# Altium project lga1700.PrjPCB (part 6 of 11)

## Sheet DDR4_UDIMM CHANNEL-A0.schdoc
size 420 x 298 mm; Symbol: Sheet-Symbol_A3; Company: 嘉立创EDA; Version: V1.0; Page Size: A3; @Project Name: 【全网首发】X86电脑主板_copy; @Page Count: 2; @Update Date: 2025-11-04; @Create Date: 2025-11-04; @Schematic Name: SCHEMATIC1_1; @Page No: 0; @Page Name: DDR4_UDIMM CHANNEL-A0; Device: Sheet-Symbol_A3
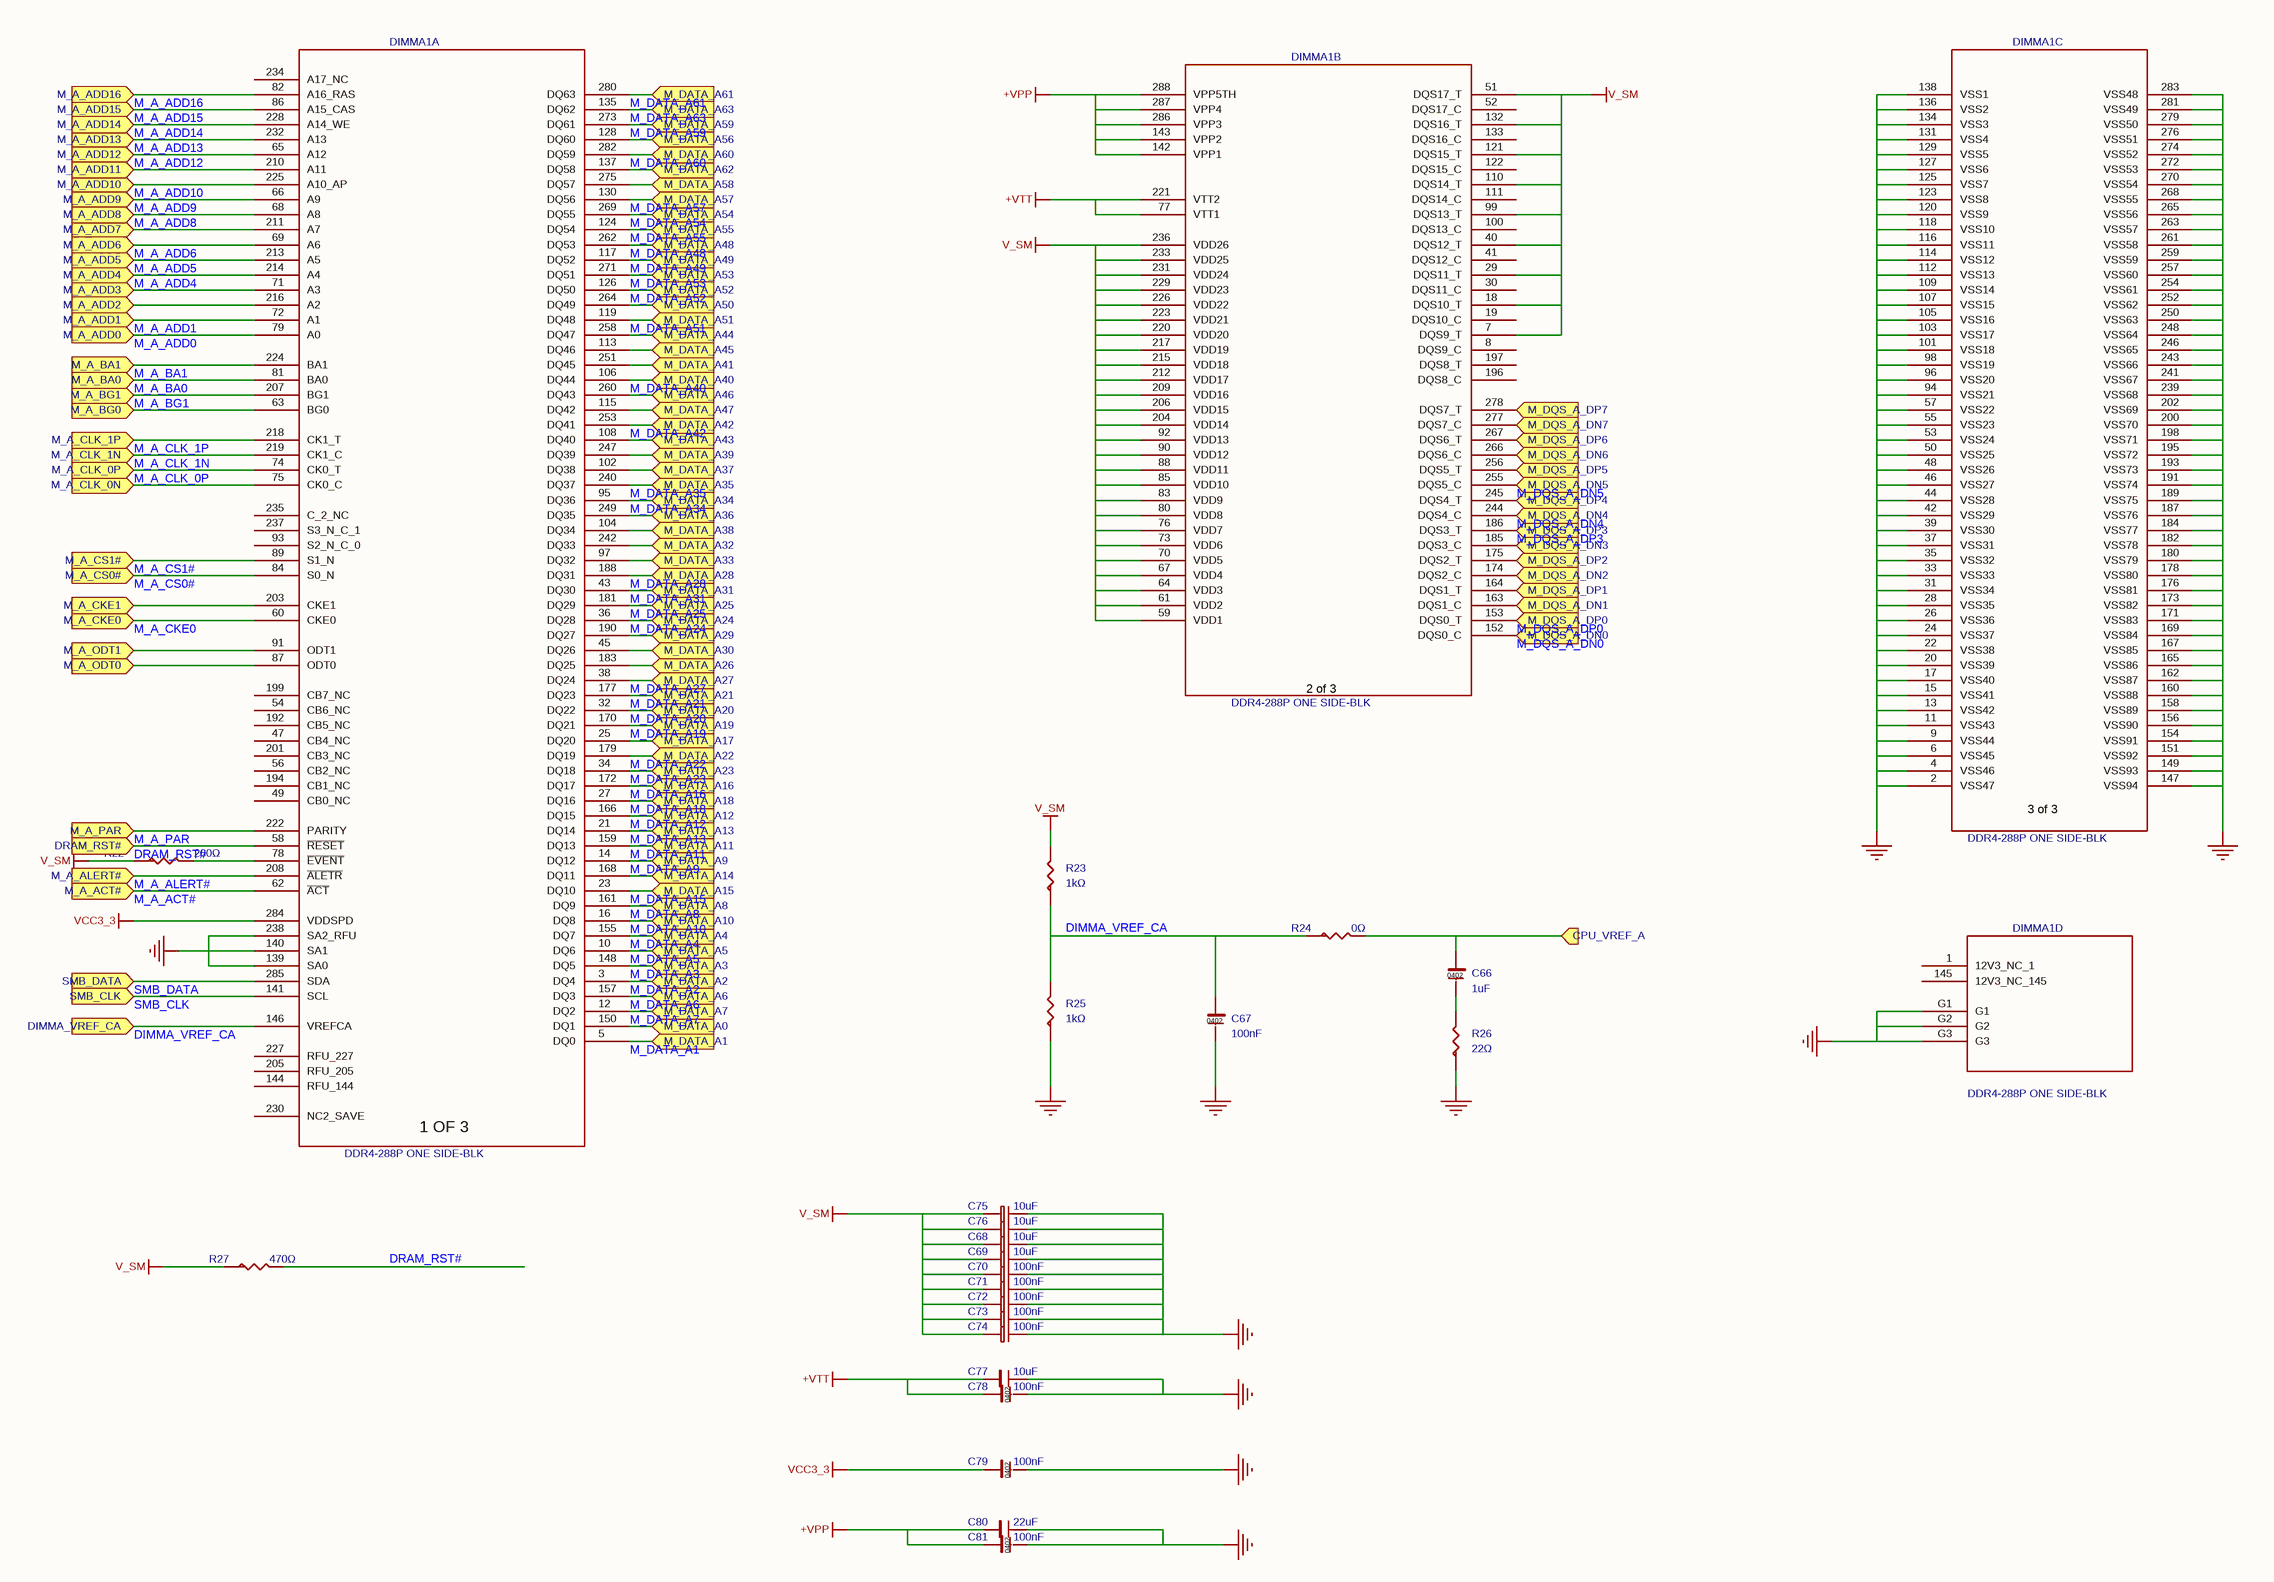
[diagram p22: DDR4_UDIMM CHANNEL-A0.schdoc]

### Parts
C66  1uF  [C0402_2]
C67  100nF  [C0402_1]
C68  10uF  [C0603_1]
C69  10uF  [C0603_1]
C70  100nF  [C0402_3]
C71  100nF  [C0402_1]
C72  100nF  [C0402_3]
C73  100nF  [C0402_3]
C74  100nF  [C0402_3]
C75  10uF  [C0603]
C76  10uF  [C0603_1]
C77  10uF  [C0603_2]
C78  100nF  [C0402_3]
C79  100nF  [C0402_3]
C80  22uF  [C0603_1]
C81  100nF  [C0402_3]
DIMMA1  value DDR4-288P ONE SIDE-BLK  [DDR4-288P-AKL_1]  (hidden comment: 90405-15112-2)  (parts A,B,C,D of 4)
R22  200Ω  [R0402_1]
R23  1kΩ  [R0402_3]
R24  0Ω  [R0402_3]
R25  1kΩ  [R0402_1]
R26  22Ω  [R0402]
R27  470Ω  [R0402_1]

### Ports
CPU_VREF_A (in), DIMMA_VREF_CA (in), DRAM_RST# (in), M_A_ACT# (in), M_A_ADD0 (in), M_A_ADD1 (in), M_A_ADD2 (in), M_A_ADD3 (in), M_A_ADD4 (in), M_A_ADD5 (in), M_A_ADD6 (in), M_A_ADD7 (in), M_A_ADD8 (in), M_A_ADD9 (in), M_A_ADD10 (in), M_A_ADD11 (in), M_A_ADD12 (in), M_A_ADD13 (in), M_A_ADD14 (in), M_A_ADD15 (in), M_A_ADD16 (in), M_A_ALERT# (in), M_A_BA0 (in), M_A_BA1 (in), M_A_BG0 (in), M_A_BG1 (in), M_A_CKE0 (in), M_A_CKE1 (in), M_A_CLK_0N (in), M_A_CLK_0P (in), M_A_CLK_1N (in), M_A_CLK_1P (in), M_A_CS0# (in), M_A_CS1# (in), M_A_ODT0 (in), M_A_ODT1 (in), M_A_PAR (in), M_DATA_A0 (in), M_DATA_A1 (in), M_DATA_A2 (in), M_DATA_A3 (in), M_DATA_A4 (in), M_DATA_A5 (in), M_DATA_A6 (in), M_DATA_A7 (in), M_DATA_A8 (in), M_DATA_A9 (in), M_DATA_A10 (in), M_DATA_A11 (in), M_DATA_A12 (in), M_DATA_A13 (in), M_DATA_A14 (in), M_DATA_A15 (in), M_DATA_A16 (in), M_DATA_A17 (in), M_DATA_A18 (in), M_DATA_A19 (in), M_DATA_A20 (in), M_DATA_A21 (in), M_DATA_A22 (in), M_DATA_A23 (in), M_DATA_A24 (in), M_DATA_A25 (in), M_DATA_A26 (in), M_DATA_A27 (in), M_DATA_A28 (in), M_DATA_A29 (in), M_DATA_A30 (in), M_DATA_A31 (in), M_DATA_A32 (in), M_DATA_A33 (in), M_DATA_A34 (in), M_DATA_A35 (in), M_DATA_A36 (in), M_DATA_A37 (in), M_DATA_A38 (in), M_DATA_A39 (in), M_DATA_A40 (in), M_DATA_A41 (in), M_DATA_A42 (in), M_DATA_A43 (in), M_DATA_A44 (in), M_DATA_A45 (in), M_DATA_A46 (in), M_DATA_A47 (in), M_DATA_A48 (in), M_DATA_A49 (in), M_DATA_A50 (in), M_DATA_A51 (in), M_DATA_A52 (in), M_DATA_A53 (in), M_DATA_A54 (in), M_DATA_A55 (in), M_DATA_A56 (in), M_DATA_A57 (in), M_DATA_A58 (in), M_DATA_A59 (in), M_DATA_A60 (in), M_DATA_A61 (in), M_DATA_A62 (in), M_DATA_A63 (in), M_DQS_A_DN0 (in), M_DQS_A_DN1 (in), M_DQS_A_DN2 (in), M_DQS_A_DN3 (in), M_DQS_A_DN4 (in), M_DQS_A_DN5 (in), M_DQS_A_DN6 (in), M_DQS_A_DN7 (in), M_DQS_A_DP0 (in), M_DQS_A_DP1 (in), M_DQS_A_DP2 (in), M_DQS_A_DP3 (in), M_DQS_A_DP4 (in), M_DQS_A_DP5 (in), M_DQS_A_DP6 (in), M_DQS_A_DP7 (in), SMB_CLK (in), SMB_DATA (in)

### Nets
+VPP: C80.1 C81.1 DIMMA1.142(VPP1) DIMMA1.143(VPP2) DIMMA1.286(VPP3) DIMMA1.287(VPP4) DIMMA1.288(VPP5TH)
+VTT: C77.1 C78.1 DIMMA1.77(VTT1) DIMMA1.221(VTT2)
GND: C67.2 C68.1 C69.1 C70.1 C71.1 C72.1 C73.1 C74.1 C75.1 C76.1 C77.2 C78.2 C79.2 C80.2 C81.2 DIMMA1.2(VSS47) DIMMA1.4(VSS46) DIMMA1.6(VSS45) DIMMA1.9(VSS44) DIMMA1.11(VSS43) DIMMA1.13(VSS42) DIMMA1.15(VSS41) DIMMA1.17(VSS40) DIMMA1.20(VSS39) DIMMA1.22(VSS38) DIMMA1.24(VSS37) DIMMA1.26(VSS36) DIMMA1.28(VSS35) DIMMA1.31(VSS34) DIMMA1.33(VSS33) DIMMA1.35(VSS32) DIMMA1.37(VSS31) DIMMA1.39(VSS30) DIMMA1.42(VSS29) DIMMA1.44(VSS28) DIMMA1.46(VSS27) DIMMA1.48(VSS26) DIMMA1.50(VSS25) DIMMA1.53(VSS24) DIMMA1.55(VSS23) DIMMA1.57(VSS22) DIMMA1.94(VSS21) DIMMA1.96(VSS20) DIMMA1.98(VSS19) DIMMA1.101(VSS18) DIMMA1.103(VSS17) DIMMA1.105(VSS16) DIMMA1.107(VSS15) DIMMA1.109(VSS14) DIMMA1.112(VSS13) DIMMA1.114(VSS12) DIMMA1.116(VSS11) DIMMA1.118(VSS10) DIMMA1.120(VSS9) DIMMA1.123(VSS8) DIMMA1.125(VSS7) DIMMA1.127(VSS6) DIMMA1.129(VSS5) DIMMA1.131(VSS4) DIMMA1.134(VSS3) DIMMA1.136(VSS2) DIMMA1.138(VSS1) DIMMA1.139(SA0) DIMMA1.140(SA1) DIMMA1.147(VSS94) DIMMA1.149(VSS93) DIMMA1.151(VSS92) DIMMA1.154(VSS91) DIMMA1.156(VSS90) DIMMA1.158(VSS89) DIMMA1.160(VSS88) DIMMA1.162(VSS87) DIMMA1.165(VSS86) DIMMA1.167(VSS85) DIMMA1.169(VSS84) DIMMA1.171(VSS83) DIMMA1.173(VSS82) DIMMA1.176(VSS81) DIMMA1.178(VSS80) DIMMA1.180(VSS79) DIMMA1.182(VSS78) DIMMA1.184(VSS77) DIMMA1.187(VSS76) DIMMA1.189(VSS75) DIMMA1.191(VSS74) DIMMA1.193(VSS73) DIMMA1.195(VSS72) DIMMA1.198(VSS71) DIMMA1.200(VSS70) DIMMA1.202(VSS69) DIMMA1.238(SA2_RFU) DIMMA1.239(VSS68) DIMMA1.241(VSS67) DIMMA1.243(VSS66) DIMMA1.246(VSS65) DIMMA1.248(VSS64) DIMMA1.250(VSS63) DIMMA1.252(VSS62) DIMMA1.254(VSS61) DIMMA1.257(VSS60) DIMMA1.259(VSS59) DIMMA1.261(VSS58) DIMMA1.263(VSS57) DIMMA1.265(VSS56) DIMMA1.268(VSS55) DIMMA1.270(VSS54) DIMMA1.272(VSS53) DIMMA1.274(VSS52) DIMMA1.276(VSS51) DIMMA1.279(VSS50) DIMMA1.281(VSS49) DIMMA1.283(VSS48) DIMMA1.G1 DIMMA1.G2 DIMMA1.G3 R25.1 R26.1
V_SM: C68.2 C69.2 C70.2 C71.2 C72.2 C73.2 C74.2 C75.2 C76.2 DIMMA1.7(DQS9_T) DIMMA1.18(DQS10_T) DIMMA1.29(DQS11_T) DIMMA1.40(DQS12_T) DIMMA1.51(DQS17_T) DIMMA1.59(VDD1) DIMMA1.61(VDD2) DIMMA1.64(VDD3) DIMMA1.67(VDD4) DIMMA1.70(VDD5) DIMMA1.73(VDD6) DIMMA1.76(VDD7) DIMMA1.80(VDD8) DIMMA1.83(VDD9) DIMMA1.85(VDD10) DIMMA1.88(VDD11) DIMMA1.90(VDD12) DIMMA1.92(VDD13) DIMMA1.99(DQS13_T) DIMMA1.110(DQS14_T) DIMMA1.121(DQS15_T) DIMMA1.132(DQS16_T) DIMMA1.204(VDD14) DIMMA1.206(VDD15) DIMMA1.209(VDD16) DIMMA1.212(VDD17) DIMMA1.215(VDD18) DIMMA1.217(VDD19) DIMMA1.220(VDD20) DIMMA1.223(VDD21) DIMMA1.226(VDD22) DIMMA1.229(VDD23) DIMMA1.231(VDD24) DIMMA1.233(VDD25) DIMMA1.236(VDD26) R22.1 R23.2 R27.1
VCC3_3: C79.1 DIMMA1.284(VDDSPD)
DIMMA_VREF_CA: C67.1 DIMMA1.146(VREFCA) R23.1 R24.1 R25.2 ; port DIMMA_VREF_CA
DRAM_RST#: DIMMA1.58(~{RESET}) R27.2 ; port DRAM_RST#
M_A_ACT#: DIMMA1.62(~{ACT}) ; port M_A_ACT#
M_A_ADD0: DIMMA1.79(A0) ; port M_A_ADD0
M_A_ADD1: DIMMA1.72(A1) ; port M_A_ADD1
M_A_ADD4: DIMMA1.214(A4) ; port M_A_ADD4
M_A_ADD5: DIMMA1.213(A5) ; port M_A_ADD5
M_A_ADD6: DIMMA1.69(A6) ; port M_A_ADD6
M_A_ADD8: DIMMA1.68(A8) ; port M_A_ADD8
M_A_ADD9: DIMMA1.66(A9) ; port M_A_ADD9
M_A_ADD10: DIMMA1.225(A10_AP) ; port M_A_ADD10
M_A_ADD12: DIMMA1.65(A12) ; port M_A_ADD12
M_A_ADD13: DIMMA1.232(A13) ; port M_A_ADD13
M_A_ADD14: DIMMA1.228(A14_WE) ; port M_A_ADD14
M_A_ADD15: DIMMA1.86(A15_CAS) ; port M_A_ADD15
M_A_ADD16: DIMMA1.82(A16_RAS) ; port M_A_ADD16
M_A_ALERT#: DIMMA1.208(~{ALETR}) ; port M_A_ALERT#
M_A_BA0: DIMMA1.81(BA0) ; port M_A_BA0
M_A_BA1: DIMMA1.224(BA1) ; port M_A_BA1
M_A_BG1: DIMMA1.207(BG1) ; port M_A_BG1
M_A_CKE0: DIMMA1.60(CKE0) ; port M_A_CKE0
M_A_CLK_0P: DIMMA1.74(CK0_T) ; port M_A_CLK_0P
M_A_CLK_1N: DIMMA1.219(CK1_C) ; port M_A_CLK_1N
M_A_CLK_1P: DIMMA1.218(CK1_T) ; port M_A_CLK_1P
M_A_CS0#: DIMMA1.84(S0_N) ; port M_A_CS0#
M_A_CS1#: DIMMA1.89(S1_N) ; port M_A_CS1#
M_A_PAR: DIMMA1.222(PARITY) ; port M_A_PAR
M_DATA_A1: DIMMA1.5(DQ0) ; port M_DATA_A1
M_DATA_A2: DIMMA1.3(DQ4) ; port M_DATA_A2
M_DATA_A3: DIMMA1.148(DQ5) ; port M_DATA_A3
M_DATA_A4: DIMMA1.155(DQ7) ; port M_DATA_A4
M_DATA_A5: DIMMA1.10(DQ6) ; port M_DATA_A5
M_DATA_A6: DIMMA1.157(DQ3) ; port M_DATA_A6
M_DATA_A7: DIMMA1.12(DQ2) ; port M_DATA_A7
M_DATA_A8: DIMMA1.161(DQ9) ; port M_DATA_A8
M_DATA_A9: DIMMA1.14(DQ12) ; port M_DATA_A9
M_DATA_A10: DIMMA1.16(DQ8) ; port M_DATA_A10
M_DATA_A11: DIMMA1.159(DQ13) ; port M_DATA_A11
M_DATA_A12: DIMMA1.166(DQ15) ; port M_DATA_A12
M_DATA_A13: DIMMA1.21(DQ14) ; port M_DATA_A13
M_DATA_A15: DIMMA1.23(DQ10) ; port M_DATA_A15
M_DATA_A16: DIMMA1.172(DQ17) ; port M_DATA_A16
M_DATA_A18: DIMMA1.27(DQ16) ; port M_DATA_A18
M_DATA_A19: DIMMA1.170(DQ21) ; port M_DATA_A19
M_DATA_A20: DIMMA1.32(DQ22) ; port M_DATA_A20
M_DATA_A21: DIMMA1.177(DQ23) ; port M_DATA_A21
M_DATA_A22: DIMMA1.179(DQ19) ; port M_DATA_A22
M_DATA_A23: DIMMA1.34(DQ18) ; port M_DATA_A23
M_DATA_A24: DIMMA1.36(DQ28) ; port M_DATA_A24
M_DATA_A25: DIMMA1.181(DQ29) ; port M_DATA_A25
M_DATA_A27: DIMMA1.38(DQ24) ; port M_DATA_A27
M_DATA_A28: DIMMA1.188(DQ31) ; port M_DATA_A28
M_DATA_A31: DIMMA1.43(DQ30) ; port M_DATA_A31
M_DATA_A34: DIMMA1.95(DQ36) ; port M_DATA_A34
M_DATA_A35: DIMMA1.240(DQ37) ; port M_DATA_A35
M_DATA_A40: DIMMA1.106(DQ44) ; port M_DATA_A40
M_DATA_A42: DIMMA1.253(DQ41) ; port M_DATA_A42
M_DATA_A48: DIMMA1.262(DQ53) ; port M_DATA_A48
M_DATA_A49: DIMMA1.117(DQ52) ; port M_DATA_A49
M_DATA_A51: DIMMA1.119(DQ48) ; port M_DATA_A51
M_DATA_A52: DIMMA1.126(DQ50) ; port M_DATA_A52
M_DATA_A53: DIMMA1.271(DQ51) ; port M_DATA_A53
M_DATA_A54: DIMMA1.269(DQ55) ; port M_DATA_A54
M_DATA_A55: DIMMA1.124(DQ54) ; port M_DATA_A55
M_DATA_A57: DIMMA1.130(DQ56) ; port M_DATA_A57
M_DATA_A59: DIMMA1.273(DQ61) ; port M_DATA_A59
M_DATA_A60: DIMMA1.282(DQ59) ; port M_DATA_A60
M_DATA_A61: DIMMA1.280(DQ63) ; port M_DATA_A61
M_DATA_A63: DIMMA1.135(DQ62) ; port M_DATA_A63
M_DQS_A_DN0: DIMMA1.152(DQS0_C) ; port M_DQS_A_DN0
M_DQS_A_DN4: DIMMA1.244(DQS4_C) ; port M_DQS_A_DN4
M_DQS_A_DN5: DIMMA1.255(DQS5_C) ; port M_DQS_A_DN5
M_DQS_A_DP0: DIMMA1.153(DQS0_T) ; port M_DQS_A_DP0
M_DQS_A_DP3: DIMMA1.186(DQS3_T) ; port M_DQS_A_DP3
SMB_CLK: DIMMA1.141(SCL) ; port SMB_CLK
SMB_DATA: DIMMA1.285(SDA) ; port SMB_DATA
NetC66_1: C66.1 R24.2 ; port CPU_VREF_A
NetC66_2: C66.2 R26.2
NetDIMMA1_25: DIMMA1.25(DQ20) ; port M_DATA_A17
NetDIMMA1_45: DIMMA1.45(DQ26) ; port M_DATA_A30
NetDIMMA1_63: DIMMA1.63(BG0) ; port M_A_BG0
NetDIMMA1_71: DIMMA1.71(A3) ; port M_A_ADD3
NetDIMMA1_75: DIMMA1.75(CK0_C) ; port M_A_CLK_0N
NetDIMMA1_78: DIMMA1.78(~{EVENT}) R22.2
NetDIMMA1_87: DIMMA1.87(ODT0) ; port M_A_ODT0
NetDIMMA1_91: DIMMA1.91(ODT1) ; port M_A_ODT1
NetDIMMA1_97: DIMMA1.97(DQ32) ; port M_DATA_A33
NetDIMMA1_102: DIMMA1.102(DQ38) ; port M_DATA_A37
NetDIMMA1_104: DIMMA1.104(DQ34) ; port M_DATA_A38
NetDIMMA1_108: DIMMA1.108(DQ40) ; port M_DATA_A43
NetDIMMA1_113: DIMMA1.113(DQ46) ; port M_DATA_A45
NetDIMMA1_115: DIMMA1.115(DQ42) ; port M_DATA_A47
NetDIMMA1_128: DIMMA1.128(DQ60) ; port M_DATA_A56
NetDIMMA1_137: DIMMA1.137(DQ58) ; port M_DATA_A62
NetDIMMA1_150: DIMMA1.150(DQ1) ; port M_DATA_A0
NetDIMMA1_163: DIMMA1.163(DQS1_C) ; port M_DQS_A_DN1
NetDIMMA1_164: DIMMA1.164(DQS1_T) ; port M_DQS_A_DP1
NetDIMMA1_168: DIMMA1.168(DQ11) ; port M_DATA_A14
NetDIMMA1_174: DIMMA1.174(DQS2_C) ; port M_DQS_A_DN2
NetDIMMA1_175: DIMMA1.175(DQS2_T) ; port M_DQS_A_DP2
NetDIMMA1_183: DIMMA1.183(DQ25) ; port M_DATA_A26
NetDIMMA1_185: DIMMA1.185(DQS3_C) ; port M_DQS_A_DN3
NetDIMMA1_190: DIMMA1.190(DQ27) ; port M_DATA_A29
NetDIMMA1_203: DIMMA1.203(CKE1) ; port M_A_CKE1
NetDIMMA1_210: DIMMA1.210(A11) ; port M_A_ADD11
NetDIMMA1_211: DIMMA1.211(A7) ; port M_A_ADD7
NetDIMMA1_216: DIMMA1.216(A2) ; port M_A_ADD2
NetDIMMA1_242: DIMMA1.242(DQ33) ; port M_DATA_A32
NetDIMMA1_245: DIMMA1.245(DQS4_T) ; port M_DQS_A_DP4
NetDIMMA1_247: DIMMA1.247(DQ39) ; port M_DATA_A39
NetDIMMA1_249: DIMMA1.249(DQ35) ; port M_DATA_A36
NetDIMMA1_251: DIMMA1.251(DQ45) ; port M_DATA_A41
NetDIMMA1_256: DIMMA1.256(DQS5_T) ; port M_DQS_A_DP5
NetDIMMA1_258: DIMMA1.258(DQ47) ; port M_DATA_A44
NetDIMMA1_260: DIMMA1.260(DQ43) ; port M_DATA_A46
NetDIMMA1_264: DIMMA1.264(DQ49) ; port M_DATA_A50
NetDIMMA1_266: DIMMA1.266(DQS6_C) ; port M_DQS_A_DN6
NetDIMMA1_267: DIMMA1.267(DQS6_T) ; port M_DQS_A_DP6
NetDIMMA1_275: DIMMA1.275(DQ57) ; port M_DATA_A58
NetDIMMA1_277: DIMMA1.277(DQS7_C) ; port M_DQS_A_DN7
NetDIMMA1_278: DIMMA1.278(DQS7_T) ; port M_DQS_A_DP7

Not connected (* = marked no-connect by the designer): DIMMA1 1(12V3_NC_1) 8(DQS9_C) 19(DQS10_C) 30(DQS11_C) 41(DQS12_C) 47(CB4_NC) 49(CB0_NC) 52(DQS17_C) 54(CB6_NC) 56(CB2_NC) 93(S2_N_C_0) 100(DQS13_C) 111(DQS14_C) 122(DQS15_C) 133(DQS16_C) 144(RFU_144) 145(12V3_NC_145) 192(CB5_NC) 194(CB1_NC) 196(DQS8_C) 197(DQS8_T) 199(CB7_NC) 201(CB3_NC) 205(RFU_205) 227(RFU_227) 230(NC2_SAVE) 234(A17_NC) 235(C_2_NC) 237(S3_N_C_1)

### Notes on the sheet
- 更新日期
- 2025-11-04
- 原理图
- 图页
- SCHEMATIC1_1
- DDR4_UDIMM CHANNEL-A0
- 创建日期
- 物料编码
- 审阅
- 绘制
- 【全网首发】X86电脑主板_copy
- 版本
- V1.0
- 尺寸
- A3
- 页
- 0
- 嘉立创EDA
- 共
- 2
- (in symbol 90405-15112-2, part A) 1 OF 3
- (in symbol 90405-15112-2, part B) 2 of 3
- (in symbol 90405-15112-2, part C) 3 of 3

### Library data of the parts
C66 = CL05A105KQ5NNNC: 容值:1uF;精度:±10%;额定电压:6.3V;材质(温度系数):X5R;; Manufacturer: SAMSUNG(三星); Symbol: C0402; AddInBom: yes; ModelId: 36a51122f27c49738f86b3bfa98863e0; ModelName: C0402_L1.0-W0.5-H0.5; ModelTransform: 39.37,19.685,0,0,0,0,0,0,0; Tolerance: ±10%; Voltage Rated: 6.3V; Temperature Coefficient: X5R; Device: CL05A105KQ5NNNC; Value: 1uF; LCSC Part Name: 1uF ±10% 6.3V; SupplierPart: C107372; ManufacturerPart: CL05A105KQ5NNNC; Supplier Footprint: 0402; JLCPCB Part Class: Extended Part; Datasheet: https://atta.szlcsc.com/upload/public/pdf/source/20160218/1457707763339.pdf; Supplier: LCSC; ConvertToPcb: yes; FootprintName: C0402_2
C67 C78 C79 C81 = CL05B104KO5NNNC: as MC99 on sheet CPU_PWR - VCCIN_AUX; Device: CL05B104KO5NNNC; Value: 100nF; Supplier: LCSC; Datasheet: https://atta.szlcsc.com/upload/public/pdf/source/20160103/1457707674891.pdf; SupplierPart: C1525; ConvertToPcb: yes; LCSC Part Name: 100nF ±10% 16V; JLCPCB Part Class: Basic Part; ManufacturerPart: CL05B104KO5NNNC; Supplier Footprint: 0402
  C67: FootprintName: C0402_1
  C78 C79 C81: FootprintName: C0402_3
C68 C69 C75 C76 = CL05A106MQ5NUNC: 容值:10uF;精度:±20%;额定电压:6.3V;材质(温度系数):X5R;; Manufacturer: SAMSUNG(三星); Symbol: CAP NP_23; ModelId: 36a51122f27c49738f86b3bfa98863e0; Tolerance: ±20%; AddInBom: yes; Voltage Rated: 6.3V; ModelName: C0402_L1.0-W0.5-H0.5; ModelTransform: 39.37,19.685,0,0,0,0,0,0,0; Temperature Coefficient: X5R; Device: CL05A106MQ5NUNC; Value: 10uF; Supplier: LCSC; Datasheet: https://atta.szlcsc.com/upload/public/pdf/source/20220823/2B02EE04F8F211D38A52DCB16EB6BEBA.pdf; SupplierPart: C15525; ConvertToPcb: yes; LCSC Part Name: 10uF ±20% 6.3V; JLCPCB Part Class: Basic Part; ManufacturerPart: CL05A106MQ5NUNC; Supplier Footprint: 0402
  C68 C69 C76: FootprintName: C0603_1
  C75: FootprintName: C0603
C70-C74 = CL05B104KO5NNNC: 容值:100nF;精度:±10%;额定电压:16V;材质(温度系数):X7R;; Manufacturer: SAMSUNG(三星); Symbol: CAP NP_23; ModelId: 36a51122f27c49738f86b3bfa98863e0; Tolerance: ±10%; AddInBom: yes; Voltage Rated: 16V; ModelName: C0402_L1.0-W0.5-H0.5; ModelTransform: 39.37,19.685,0,0,0,0,0,0,0; Temperature Coefficient: X7R; Device: CL05B104KO5NNNC; Value: 100nF; Supplier: LCSC; Datasheet: https://atta.szlcsc.com/upload/public/pdf/source/20160103/1457707674891.pdf; SupplierPart: C1525; ConvertToPcb: yes; LCSC Part Name: 100nF ±10% 16V; JLCPCB Part Class: Basic Part; ManufacturerPart: CL05B104KO5NNNC; Supplier Footprint: 0402
  C70 C72-C74: FootprintName: C0402_3
  C71: FootprintName: C0402_1
C77 = CL10A106KP8NNNC: 容值:10uF;精度:±10%;额定电压:10V;材质(温度系数):X5R;; Manufacturer: SAMSUNG(三星); Symbol: C0805; ModelId: ac125912035d415993ca9572d50418b1; Tolerance: ±10%; AddInBom: yes; Voltage Rated: 10V; ModelName: C0603_L1.6-W0.8-H0.8; ModelTransform: 62.992,31.496,0,0,0,0,0,0,0; Temperature Coefficient: X5R; Device: CL10A106KP8NNNC; Value: 10uF; Supplier: LCSC; Datasheet: https://atta.szlcsc.com/upload/public/pdf/source/20160103/1457707703378.pdf; FootprintName: C0603_2; SupplierPart: C19702; ConvertToPcb: yes; LCSC Part Name: 10uF ±10% 10V; JLCPCB Part Class: Basic Part; ManufacturerPart: CL10A106KP8NNNC; Supplier Footprint: 0603
C80 = CL10A226MQ8NRNC: 容值:22uF;精度:±20%;额定电压:6.3V;材质(温度系数):X5R;; Manufacturer: SAMSUNG(三星); Symbol: C0805; AddInBom: yes; Tolerance: ±20%; Voltage Rated: 6.3V; Temperature Coefficient: X5R; ModelId: ac125912035d415993ca9572d50418b1; ModelName: C0603_L1.6-W0.8-H0.8; ModelTransform: 62.992,31.496,0,0,0,0,0,0,0; Device: CL10A226MQ8NRNC; Value: 22uF; LCSC Part Name: 22uF ±20% 6.3V; SupplierPart: C59461; ManufacturerPart: CL10A226MQ8NRNC; Supplier Footprint: 0603; JLCPCB Part Class: Basic Part; Datasheet: https://atta.szlcsc.com/upload/public/pdf/source/20160218/1457707763339.pdf; Supplier: LCSC; ConvertToPcb: yes; FootprintName: C0603_1
DIMMA1 = 90405-15112-2: 连接器类型:DDR4;间距:0.85mm;引脚总数:288P;安装方式:直插;工作温度范围:-55℃~+105℃;; Manufacturer: UMaxconn(友贸); Symbol: DDR4_0; AddInBom: yes; ModelId: 99c36b498e914ce59dfe50adf1b55e89; ModelName: CONN-TH_288P-90405; ModelTransform: 5799.201,244.488,0,0,0,0,0,0,-157.48; Connector Type: DDR4; Pitch: 0.85mm; Device: 90405-15112-2; LCSC Part Name: 0.85mm P数:288P; SupplierPart: C2922446; ManufacturerPart: 90405-15112-2; Supplier Footprint: 插件,P=0.85mm; JLCPCB Part Class: Extended Part; Datasheet: https://atta.szlcsc.com/upload/public/pdf/source/20211119/8F83E07E75D2FB3E34252D81E838E37C.pdf; Supplier: LCSC; ConvertToPcb: yes; FootprintName: DDR4-288P-AKL_1; Number of Pins: 288P; Mounting Style: 直插; Height Above Board: 21mm; Contact Material: 铜合金; Contact Plating: 金; Operating Temperature Range: -55℃~+105℃
R22 = 0402WGF2000TCE: 电阻类型:厚膜电阻;阻值:200Ω;精度:±1%;功率:62.5mW;; Manufacturer: UNI-ROYAL(厚声); Symbol: 42A**-F; PCB Footprint: R0402; ModelId: 671aefced39d4c318694bba8bd8efd39; Tolerance: ±1%; AddInBom: yes; Power(Watts): 62.5mW; ModelName: R0402_L1.0-W0.5-H0.5; ModelTransform: 39.37,19.685,0,0,0,0,0,0.0005,0; Overload Voltage (Max): 50V; Temperature Coefficient: ±100ppm/℃; Device: 0402WGF2000TCE; Value: 200Ω; Type: 厚膜电阻; Supplier: LCSC; Datasheet: https://atta.szlcsc.com/upload/public/pdf/source/20200306/C422600_1E6D84923E4A46A82E41ADD87F860B5C.pdf; FootprintName: R0402_1; SupplierPart: C25087; ConvertToPcb: yes; LCSC Part Name: 200Ω ±1% 62.5mW; JLCPCB Part Class: Basic Part; ManufacturerPart: 0402WGF2000TCE; Supplier Footprint: 0402; Operating Temperature Range: -55℃~+155℃
R23 R25 = 0402WGF1001TCE: 电阻类型:厚膜电阻;阻值:1kΩ;精度:±1%;功率:62.5mW;; Manufacturer: UNI-ROYAL(厚声); Symbol: R; ModelId: 671aefced39d4c318694bba8bd8efd39; Tolerance: ±1%; AddInBom: yes; Power(Watts): 62.5mW; ModelName: R0402_L1.0-W0.5-H0.5; ModelTransform: 39.37,19.685,0,0,0,0,0,0.0005,0; Overload Voltage (Max): 50V; Temperature Coefficient: ±100ppm/℃; Device: 0402WGF1001TCE; Value: 1kΩ; Type: 厚膜电阻; Supplier: LCSC; Datasheet: https://atta.szlcsc.com/upload/public/pdf/source/20200306/C422600_1E6D84923E4A46A82E41ADD87F860B5C.pdf; SupplierPart: C11702; ConvertToPcb: yes; LCSC Part Name: 1kΩ ±1% 62.5mW; JLCPCB Part Class: Basic Part; ManufacturerPart: 0402WGF1001TCE; Supplier Footprint: 0402; Operating Temperature Range: -55℃~+155℃
  R23: FootprintName: R0402_3
  R25: FootprintName: R0402_1
R24 = 0402WGF0000TCE: 电阻类型:厚膜电阻;阻值:0Ω;精度:±1%;功率:62.5mW;; Manufacturer: UNI-ROYAL(厚声); Symbol: R; ModelId: 671aefced39d4c318694bba8bd8efd39; Tolerance: ±1%; AddInBom: yes; Power(Watts): 62.5mW; ModelName: R0402_L1.0-W0.5-H0.5; ModelTransform: 39.37,19.685,0,0,0,0,0,0.0005,0; Overload Voltage (Max): 50V; Temperature Coefficient: ±800ppm/℃; Device: 0402WGF0000TCE; Value: 0Ω; Type: 厚膜电阻; Supplier: LCSC; Datasheet: https://atta.szlcsc.com/upload/public/pdf/source/20200306/C422600_1E6D84923E4A46A82E41ADD87F860B5C.pdf; FootprintName: R0402_3; SupplierPart: C17168; ConvertToPcb: yes; LCSC Part Name: 0Ω ±1% 62.5mW; JLCPCB Part Class: Basic Part; ManufacturerPart: 0402WGF0000TCE; Supplier Footprint: 0402; Operating Temperature Range: -55℃~+155℃
R26 = 0402WGF220JTCE: 电阻类型:厚膜电阻;阻值:22Ω;精度:±1%;功率:62.5mW;温度系数:±100ppm/℃;; Manufacturer: UNI-ROYAL(厚声); Symbol: R; ModelId: 671aefced39d4c318694bba8bd8efd39; Tolerance: ±1%; AddInBom: yes; Power(Watts): 62.5mW; ModelName: R0402_L1.0-W0.5-H0.5; ModelTransform: 39.37,19.685,0,0,0,0,0,0.0005,0; Overload Voltage (Max): 50V; Device: 0402WGF220JTCE; Value: 22Ω; Type: 厚膜电阻; Supplier: LCSC; Datasheet: https://atta.szlcsc.com/upload/public/pdf/source/20200306/C422600_1E6D84923E4A46A82E41ADD87F860B5C.pdf; FootprintName: R0402; SupplierPart: C25092; ConvertToPcb: yes; LCSC Part Name: 厚膜电阻 22Ω ±1% 62.5mW; JLCPCB Part Class: Basic Part; ManufacturerPart: 0402WGF220JTCE; Supplier Footprint: 0402; Temperature Coefficient: ±100ppm/℃; Operating Temperature Range: -55℃~+155℃
R27 = 0402WGF4700TCE: 电阻类型:厚膜电阻;阻值:470Ω;精度:±1%;功率:62.5mW;; Manufacturer: UNI-ROYAL(厚声); Symbol: 42A**-F; PCB Footprint: R0402; ModelId: 671aefced39d4c318694bba8bd8efd39; Tolerance: ±1%; AddInBom: yes; Power(Watts): 62.5mW; ModelName: R0402_L1.0-W0.5-H0.5; ModelTransform: 39.37,19.685,0,0,0,0,0,0.0005,0; Overload Voltage (Max): 50V; Temperature Coefficient: ±100ppm/℃; Device: 0402WGF4700TCE; Value: 470Ω; Type: 厚膜电阻; Supplier: LCSC; Datasheet: https://atta.szlcsc.com/upload/public/pdf/source/20200306/C422600_1E6D84923E4A46A82E41ADD87F860B5C.pdf; FootprintName: R0402_1; SupplierPart: C25117; ConvertToPcb: yes; LCSC Part Name: 470Ω ±1% 62.5mW; JLCPCB Part Class: Basic Part; ManufacturerPart: 0402WGF4700TCE; Supplier Footprint: 0402; Operating Temperature Range: -55℃~+155℃

## Sheet DDR4_UDIMM CHANNEL-B0.schdoc
size 420 x 298 mm; Symbol: Sheet-Symbol_A3; Company: 嘉立创EDA; Version: V1.0; Page Size: A3; @Project Name: H610(2024/12/09); @Page Count: 36; @Update Date: 2025-10-09; @Create Date: 2025-10-09; @Schematic Name: SCHEMATIC1; @Page No: 7; @Page Name: DDR4_UDIMM CHANNEL-B0; Device: Sheet-Symbol_A3; @Board Name: SCHEMATIC1; @Create Time: 10:15:40; @Update Time: 10:18:17
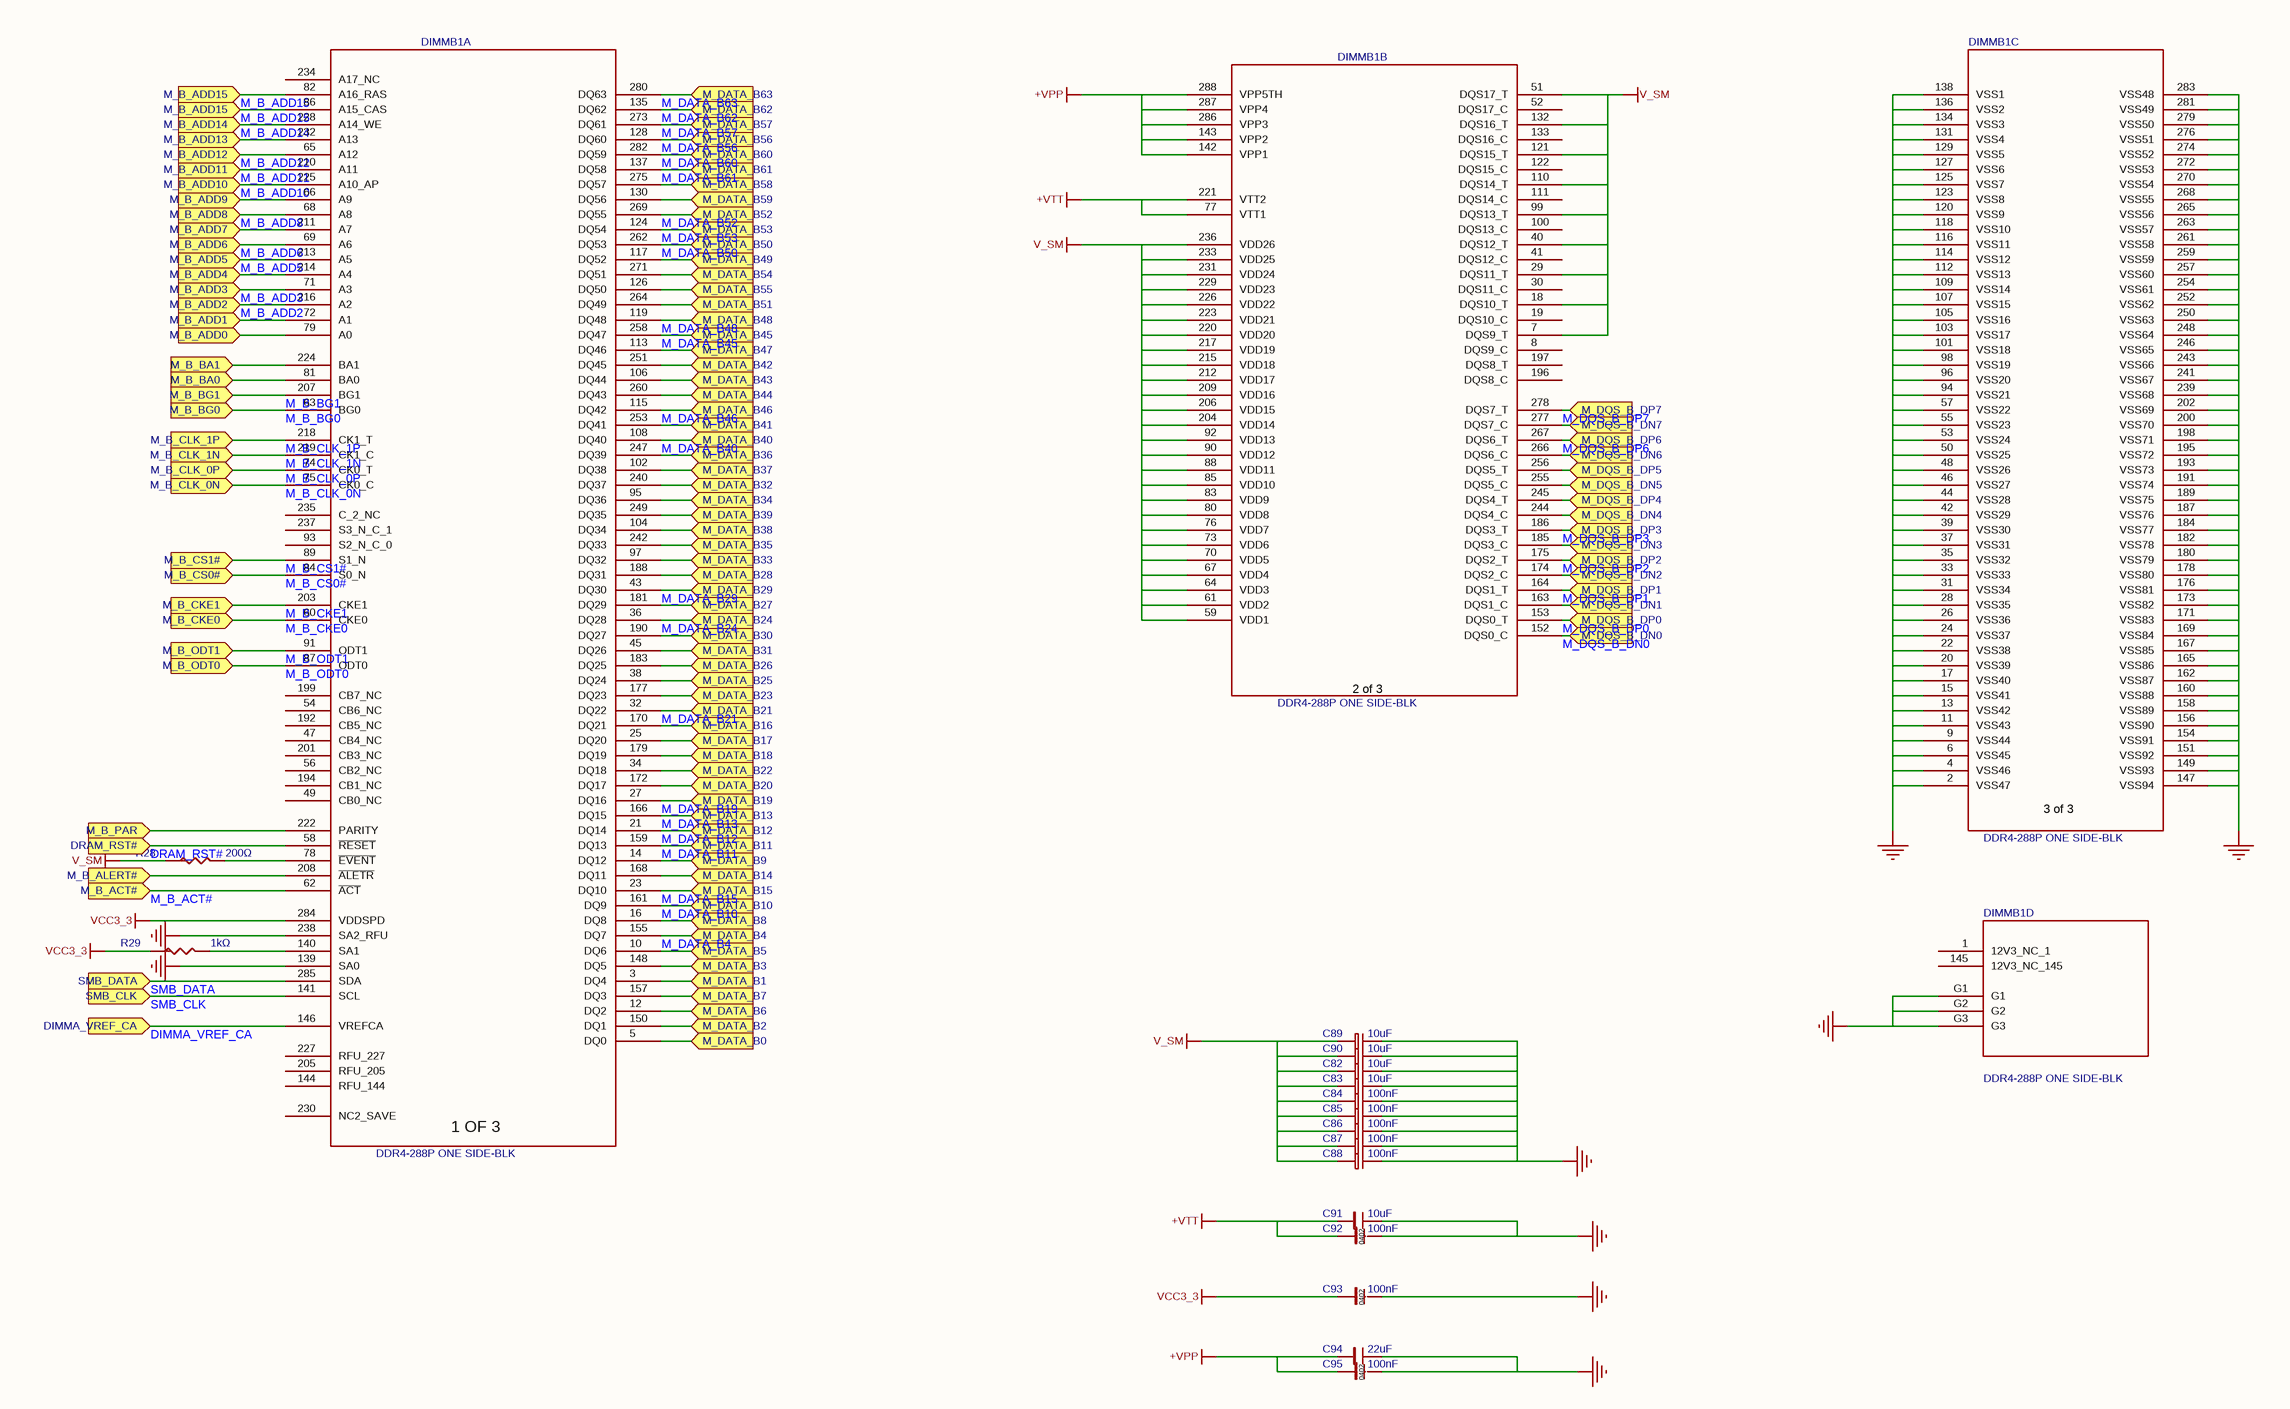
[diagram p23: DDR4_UDIMM CHANNEL-B0.schdoc]

### Parts
C82  10uF  [C0603_1]
C83  10uF  [C0603_1]
C84  100nF  [C0402_1]
C85  100nF  [C0402_3]
C86  100nF  [C0402_3]
C87  100nF  [C0402_1]
C88  100nF  [C0402_3]
C89  10uF  [C0603_2]
C90  10uF  [C0603_2]
C91  10uF  [C0603_1]
C92  100nF  [C0402_1]
C93  100nF  [C0402_3]
C94  22uF  [C0603_2]
C95  100nF  [C0402_1]
DIMMB1  value DDR4-288P ONE SIDE-BLK  [DDR4-288P-AKL_1]  (hidden comment: 90405-15112-2)  (parts A,B,C,D of 4)
R28  200Ω  [R0402_1]
R29  1kΩ  [R0402_3]

### Ports
DIMMA_VREF_CA (in), DRAM_RST# (in), M_B_ACT# (in), M_B_ADD0 (in), M_B_ADD1 (in), M_B_ADD2 (in), M_B_ADD3 (in), M_B_ADD4 (in), M_B_ADD5 (in), M_B_ADD6 (in), M_B_ADD7 (in), M_B_ADD8 (in), M_B_ADD9 (in), M_B_ADD10 (in), M_B_ADD11 (in), M_B_ADD12 (in), M_B_ADD13 (in), M_B_ADD14 (in), M_B_ADD15 (in), M_B_ALERT# (in), M_B_BA0 (in), M_B_BA1 (in), M_B_BG0 (in), M_B_BG1 (in), M_B_CKE0 (in), M_B_CKE1 (in), M_B_CLK_0N (in), M_B_CLK_0P (in), M_B_CLK_1N (in), M_B_CLK_1P (in), M_B_CS0# (in), M_B_CS1# (in), M_B_ODT0 (in), M_B_ODT1 (in), M_B_PAR (in), M_DATA_B0 (in), M_DATA_B1 (in), M_DATA_B2 (in), M_DATA_B3 (in), M_DATA_B4 (in), M_DATA_B5 (in), M_DATA_B6 (in), M_DATA_B7 (in), M_DATA_B8 (in), M_DATA_B9 (in), M_DATA_B10 (in), M_DATA_B11 (in), M_DATA_B12 (in), M_DATA_B13 (in), M_DATA_B14 (in), M_DATA_B15 (in), M_DATA_B16 (in), M_DATA_B17 (in), M_DATA_B18 (in), M_DATA_B19 (in), M_DATA_B20 (in), M_DATA_B21 (in), M_DATA_B22 (in), M_DATA_B23 (in), M_DATA_B24 (in), M_DATA_B25 (in), M_DATA_B26 (in), M_DATA_B27 (in), M_DATA_B28 (in), M_DATA_B29 (in), M_DATA_B30 (in), M_DATA_B31 (in), M_DATA_B32 (in), M_DATA_B33 (in), M_DATA_B34 (in), M_DATA_B35 (in), M_DATA_B36 (in), M_DATA_B37 (in), M_DATA_B38 (in), M_DATA_B39 (in), M_DATA_B40 (in), M_DATA_B41 (in), M_DATA_B42 (in), M_DATA_B43 (in), M_DATA_B44 (in), M_DATA_B45 (in), M_DATA_B46 (in), M_DATA_B47 (in), M_DATA_B48 (in), M_DATA_B49 (in), M_DATA_B50 (in), M_DATA_B51 (in), M_DATA_B52 (in), M_DATA_B53 (in), M_DATA_B54 (in), M_DATA_B55 (in), M_DATA_B56 (in), M_DATA_B57 (in), M_DATA_B58 (in), M_DATA_B59 (in), M_DATA_B60 (in), M_DATA_B61 (in), M_DATA_B62 (in), M_DATA_B63 (in), M_DQS_B_DN0 (in), M_DQS_B_DN1 (in), M_DQS_B_DN2 (in), M_DQS_B_DN3 (in), M_DQS_B_DN4 (in), M_DQS_B_DN5 (in), M_DQS_B_DN6 (in), M_DQS_B_DN7 (in), M_DQS_B_DP0 (in), M_DQS_B_DP1 (in), M_DQS_B_DP2 (in), M_DQS_B_DP3 (in), M_DQS_B_DP4 (in), M_DQS_B_DP5 (in), M_DQS_B_DP6 (in), M_DQS_B_DP7 (in), SMB_CLK (in), SMB_DATA (in)

### Nets
+VPP: C94.1 C95.1 DIMMB1.142(VPP1) DIMMB1.143(VPP2) DIMMB1.286(VPP3) DIMMB1.287(VPP4) DIMMB1.288(VPP5TH)
+VTT: C91.1 C92.1 DIMMB1.77(VTT1) DIMMB1.221(VTT2)
GND: C82.1 C83.1 C84.1 C85.1 C86.1 C87.1 C88.1 C89.1 C90.1 C91.2 C92.2 C93.2 C94.2 C95.2 DIMMB1.2(VSS47) DIMMB1.4(VSS46) DIMMB1.6(VSS45) DIMMB1.9(VSS44) DIMMB1.11(VSS43) DIMMB1.13(VSS42) DIMMB1.15(VSS41) DIMMB1.17(VSS40) DIMMB1.20(VSS39) DIMMB1.22(VSS38) DIMMB1.24(VSS37) DIMMB1.26(VSS36) DIMMB1.28(VSS35) DIMMB1.31(VSS34) DIMMB1.33(VSS33) DIMMB1.35(VSS32) DIMMB1.37(VSS31) DIMMB1.39(VSS30) DIMMB1.42(VSS29) DIMMB1.44(VSS28) DIMMB1.46(VSS27) DIMMB1.48(VSS26) DIMMB1.50(VSS25) DIMMB1.53(VSS24) DIMMB1.55(VSS23) DIMMB1.57(VSS22) DIMMB1.94(VSS21) DIMMB1.96(VSS20) DIMMB1.98(VSS19) DIMMB1.101(VSS18) DIMMB1.103(VSS17) DIMMB1.105(VSS16) DIMMB1.107(VSS15) DIMMB1.109(VSS14) DIMMB1.112(VSS13) DIMMB1.114(VSS12) DIMMB1.116(VSS11) DIMMB1.118(VSS10) DIMMB1.120(VSS9) DIMMB1.123(VSS8) DIMMB1.125(VSS7) DIMMB1.127(VSS6) DIMMB1.129(VSS5) DIMMB1.131(VSS4) DIMMB1.134(VSS3) DIMMB1.136(VSS2) DIMMB1.138(VSS1) DIMMB1.139(SA0) DIMMB1.147(VSS94) DIMMB1.149(VSS93) DIMMB1.151(VSS92) DIMMB1.154(VSS91) DIMMB1.156(VSS90) DIMMB1.158(VSS89) DIMMB1.160(VSS88) DIMMB1.162(VSS87) DIMMB1.165(VSS86) DIMMB1.167(VSS85) DIMMB1.169(VSS84) DIMMB1.171(VSS83) DIMMB1.173(VSS82) DIMMB1.176(VSS81) DIMMB1.178(VSS80) DIMMB1.180(VSS79) DIMMB1.182(VSS78) DIMMB1.184(VSS77) DIMMB1.187(VSS76) DIMMB1.189(VSS75) DIMMB1.191(VSS74) DIMMB1.193(VSS73) DIMMB1.195(VSS72) DIMMB1.198(VSS71) DIMMB1.200(VSS70) DIMMB1.202(VSS69) DIMMB1.238(SA2_RFU) DIMMB1.239(VSS68) DIMMB1.241(VSS67) DIMMB1.243(VSS66) DIMMB1.246(VSS65) DIMMB1.248(VSS64) DIMMB1.250(VSS63) DIMMB1.252(VSS62) DIMMB1.254(VSS61) DIMMB1.257(VSS60) DIMMB1.259(VSS59) DIMMB1.261(VSS58) DIMMB1.263(VSS57) DIMMB1.265(VSS56) DIMMB1.268(VSS55) DIMMB1.270(VSS54) DIMMB1.272(VSS53) DIMMB1.274(VSS52) DIMMB1.276(VSS51) DIMMB1.279(VSS50) DIMMB1.281(VSS49) DIMMB1.283(VSS48) DIMMB1.G1 DIMMB1.G2 DIMMB1.G3
V_SM: C82.2 C83.2 C84.2 C85.2 C86.2 C87.2 C88.2 C89.2 C90.2 DIMMB1.7(DQS9_T) DIMMB1.18(DQS10_T) DIMMB1.29(DQS11_T) DIMMB1.40(DQS12_T) DIMMB1.51(DQS17_T) DIMMB1.59(VDD1) DIMMB1.61(VDD2) DIMMB1.64(VDD3) DIMMB1.67(VDD4) DIMMB1.70(VDD5) DIMMB1.73(VDD6) DIMMB1.76(VDD7) DIMMB1.80(VDD8) DIMMB1.83(VDD9) DIMMB1.85(VDD10) DIMMB1.88(VDD11) DIMMB1.90(VDD12) DIMMB1.92(VDD13) DIMMB1.99(DQS13_T) DIMMB1.110(DQS14_T) DIMMB1.121(DQS15_T) DIMMB1.132(DQS16_T) DIMMB1.204(VDD14) DIMMB1.206(VDD15) DIMMB1.209(VDD16) DIMMB1.212(VDD17) DIMMB1.215(VDD18) DIMMB1.217(VDD19) DIMMB1.220(VDD20) DIMMB1.223(VDD21) DIMMB1.226(VDD22) DIMMB1.229(VDD23) DIMMB1.231(VDD24) DIMMB1.233(VDD25) DIMMB1.236(VDD26) R28.1
VCC3_3: C93.1 DIMMB1.284(VDDSPD) R29.1
DIMMA_VREF_CA: DIMMB1.146(VREFCA) ; port DIMMA_VREF_CA
DRAM_RST#: DIMMB1.58(~{RESET}) ; port DRAM_RST#
M_B_ACT#: DIMMB1.62(~{ACT}) ; port M_B_ACT#
M_B_ADD2: DIMMB1.216(A2) ; port M_B_ADD2
M_B_ADD3: DIMMB1.71(A3) ; port M_B_ADD3
M_B_ADD5: DIMMB1.213(A5) ; port M_B_ADD5
M_B_ADD6: DIMMB1.69(A6) ; port M_B_ADD6
M_B_ADD8: DIMMB1.68(A8) ; port M_B_ADD8
M_B_ADD10: DIMMB1.225(A10_AP) ; port M_B_ADD10
M_B_ADD11: DIMMB1.210(A11) ; port M_B_ADD11
M_B_ADD12: DIMMB1.65(A12) ; port M_B_ADD12
M_B_ADD14: DIMMB1.228(A14_WE) ; port M_B_ADD14
M_B_ADD15: DIMMB1.82(A16_RAS) DIMMB1.86(A15_CAS) ; port M_B_ADD15
M_B_BG0: DIMMB1.63(BG0) ; port M_B_BG0
M_B_BG1: DIMMB1.207(BG1) ; port M_B_BG1
M_B_CKE0: DIMMB1.60(CKE0) ; port M_B_CKE0
M_B_CKE1: DIMMB1.203(CKE1) ; port M_B_CKE1
M_B_CLK_0N: DIMMB1.75(CK0_C) ; port M_B_CLK_0N
M_B_CLK_0P: DIMMB1.74(CK0_T) ; port M_B_CLK_0P
M_B_CLK_1N: DIMMB1.219(CK1_C) ; port M_B_CLK_1N
M_B_CLK_1P: DIMMB1.218(CK1_T) ; port M_B_CLK_1P
M_B_CS0#: DIMMB1.84(S0_N) ; port M_B_CS0#
M_B_CS1#: DIMMB1.89(S1_N) ; port M_B_CS1#
M_B_ODT0: DIMMB1.87(ODT0) ; port M_B_ODT0
M_B_ODT1: DIMMB1.91(ODT1) ; port M_B_ODT1
M_DATA_B4: DIMMB1.155(DQ7) ; port M_DATA_B4
M_DATA_B10: DIMMB1.161(DQ9) ; port M_DATA_B10
M_DATA_B11: DIMMB1.159(DQ13) ; port M_DATA_B11
M_DATA_B12: DIMMB1.21(DQ14) ; port M_DATA_B12
M_DATA_B13: DIMMB1.166(DQ15) ; port M_DATA_B13
M_DATA_B15: DIMMB1.23(DQ10) ; port M_DATA_B15
M_DATA_B19: DIMMB1.27(DQ16) ; port M_DATA_B19
M_DATA_B21: DIMMB1.32(DQ22) ; port M_DATA_B21
M_DATA_B24: DIMMB1.36(DQ28) ; port M_DATA_B24
M_DATA_B29: DIMMB1.43(DQ30) ; port M_DATA_B29
M_DATA_B40: DIMMB1.108(DQ40) ; port M_DATA_B40
M_DATA_B45: DIMMB1.258(DQ47) ; port M_DATA_B45
M_DATA_B46: DIMMB1.115(DQ42) ; port M_DATA_B46
M_DATA_B48: DIMMB1.119(DQ48) ; port M_DATA_B48
M_DATA_B50: DIMMB1.262(DQ53) ; port M_DATA_B50
M_DATA_B52: DIMMB1.269(DQ55) ; port M_DATA_B52
M_DATA_B53: DIMMB1.124(DQ54) ; port M_DATA_B53
M_DATA_B56: DIMMB1.128(DQ60) ; port M_DATA_B56
M_DATA_B57: DIMMB1.273(DQ61) ; port M_DATA_B57
M_DATA_B60: DIMMB1.282(DQ59) ; port M_DATA_B60
M_DATA_B61: DIMMB1.137(DQ58) ; port M_DATA_B61
M_DATA_B62: DIMMB1.135(DQ62) ; port M_DATA_B62
M_DATA_B63: DIMMB1.280(DQ63) ; port M_DATA_B63
M_DQS_B_DN0: DIMMB1.152(DQS0_C) ; port M_DQS_B_DN0
M_DQS_B_DP0: DIMMB1.153(DQS0_T) ; port M_DQS_B_DP0
M_DQS_B_DP1: DIMMB1.164(DQS1_T) ; port M_DQS_B_DP1
M_DQS_B_DP2: DIMMB1.175(DQS2_T) ; port M_DQS_B_DP2
M_DQS_B_DP3: DIMMB1.186(DQS3_T) ; port M_DQS_B_DP3
M_DQS_B_DP6: DIMMB1.267(DQS6_T) ; port M_DQS_B_DP6
M_DQS_B_DP7: DIMMB1.278(DQS7_T) ; port M_DQS_B_DP7
SMB_CLK: DIMMB1.141(SCL) ; port SMB_CLK
SMB_DATA: DIMMB1.285(SDA) ; port SMB_DATA
NetDIMMB1_3: DIMMB1.3(DQ4) ; port M_DATA_B1
NetDIMMB1_5: DIMMB1.5(DQ0) ; port M_DATA_B0
NetDIMMB1_10: DIMMB1.10(DQ6) ; port M_DATA_B5
NetDIMMB1_12: DIMMB1.12(DQ2) ; port M_DATA_B6
NetDIMMB1_14: DIMMB1.14(DQ12) ; port M_DATA_B9
NetDIMMB1_16: DIMMB1.16(DQ8) ; port M_DATA_B8
NetDIMMB1_25: DIMMB1.25(DQ20) ; port M_DATA_B17
NetDIMMB1_34: DIMMB1.34(DQ18) ; port M_DATA_B22
NetDIMMB1_38: DIMMB1.38(DQ24) ; port M_DATA_B25
NetDIMMB1_45: DIMMB1.45(DQ26) ; port M_DATA_B31
NetDIMMB1_66: DIMMB1.66(A9) ; port M_B_ADD9
NetDIMMB1_72: DIMMB1.72(A1) ; port M_B_ADD1
NetDIMMB1_78: DIMMB1.78(~{EVENT}) R28.2
NetDIMMB1_79: DIMMB1.79(A0) ; port M_B_ADD0
NetDIMMB1_81: DIMMB1.81(BA0) ; port M_B_BA0
NetDIMMB1_95: DIMMB1.95(DQ36) ; port M_DATA_B34
NetDIMMB1_97: DIMMB1.97(DQ32) ; port M_DATA_B33
NetDIMMB1_102: DIMMB1.102(DQ38) ; port M_DATA_B37
NetDIMMB1_104: DIMMB1.104(DQ34) ; port M_DATA_B38
NetDIMMB1_106: DIMMB1.106(DQ44) ; port M_DATA_B43
NetDIMMB1_113: DIMMB1.113(DQ46) ; port M_DATA_B47
NetDIMMB1_117: DIMMB1.117(DQ52) ; port M_DATA_B49
NetDIMMB1_126: DIMMB1.126(DQ50) ; port M_DATA_B55
NetDIMMB1_130: DIMMB1.130(DQ56) ; port M_DATA_B59
NetDIMMB1_140: DIMMB1.140(SA1) R29.2
NetDIMMB1_148: DIMMB1.148(DQ5) ; port M_DATA_B3
NetDIMMB1_150: DIMMB1.150(DQ1) ; port M_DATA_B2
NetDIMMB1_157: DIMMB1.157(DQ3) ; port M_DATA_B7
NetDIMMB1_163: DIMMB1.163(DQS1_C) ; port M_DQS_B_DN1
NetDIMMB1_168: DIMMB1.168(DQ11) ; port M_DATA_B14
NetDIMMB1_170: DIMMB1.170(DQ21) ; port M_DATA_B16
NetDIMMB1_172: DIMMB1.172(DQ17) ; port M_DATA_B20
NetDIMMB1_174: DIMMB1.174(DQS2_C) ; port M_DQS_B_DN2
NetDIMMB1_177: DIMMB1.177(DQ23) ; port M_DATA_B23
NetDIMMB1_179: DIMMB1.179(DQ19) ; port M_DATA_B18
NetDIMMB1_181: DIMMB1.181(DQ29) ; port M_DATA_B27
NetDIMMB1_183: DIMMB1.183(DQ25) ; port M_DATA_B26
NetDIMMB1_185: DIMMB1.185(DQS3_C) ; port M_DQS_B_DN3
NetDIMMB1_188: DIMMB1.188(DQ31) ; port M_DATA_B28
NetDIMMB1_190: DIMMB1.190(DQ27) ; port M_DATA_B30
NetDIMMB1_208: DIMMB1.208(~{ALETR}) ; port M_B_ALERT#
NetDIMMB1_211: DIMMB1.211(A7) ; port M_B_ADD7
NetDIMMB1_214: DIMMB1.214(A4) ; port M_B_ADD4
NetDIMMB1_222: DIMMB1.222(PARITY) ; port M_B_PAR
NetDIMMB1_224: DIMMB1.224(BA1) ; port M_B_BA1
NetDIMMB1_232: DIMMB1.232(A13) ; port M_B_ADD13
NetDIMMB1_240: DIMMB1.240(DQ37) ; port M_DATA_B32
NetDIMMB1_242: DIMMB1.242(DQ33) ; port M_DATA_B35
NetDIMMB1_244: DIMMB1.244(DQS4_C) ; port M_DQS_B_DN4
NetDIMMB1_245: DIMMB1.245(DQS4_T) ; port M_DQS_B_DP4
NetDIMMB1_247: DIMMB1.247(DQ39) ; port M_DATA_B36
NetDIMMB1_249: DIMMB1.249(DQ35) ; port M_DATA_B39
NetDIMMB1_251: DIMMB1.251(DQ45) ; port M_DATA_B42
NetDIMMB1_253: DIMMB1.253(DQ41) ; port M_DATA_B41
NetDIMMB1_255: DIMMB1.255(DQS5_C) ; port M_DQS_B_DN5
NetDIMMB1_256: DIMMB1.256(DQS5_T) ; port M_DQS_B_DP5
NetDIMMB1_260: DIMMB1.260(DQ43) ; port M_DATA_B44
NetDIMMB1_264: DIMMB1.264(DQ49) ; port M_DATA_B51
NetDIMMB1_266: DIMMB1.266(DQS6_C) ; port M_DQS_B_DN6
NetDIMMB1_271: DIMMB1.271(DQ51) ; port M_DATA_B54
NetDIMMB1_275: DIMMB1.275(DQ57) ; port M_DATA_B58
NetDIMMB1_277: DIMMB1.277(DQS7_C) ; port M_DQS_B_DN7

Not connected (* = marked no-connect by the designer): DIMMB1 1(12V3_NC_1) 8(DQS9_C) 19(DQS10_C) 30(DQS11_C) 41(DQS12_C) 47(CB4_NC) 49(CB0_NC) 52(DQS17_C) 54(CB6_NC) 56(CB2_NC) 93(S2_N_C_0) 100(DQS13_C) 111(DQS14_C) 122(DQS15_C) 133(DQS16_C) 144(RFU_144) 145(12V3_NC_145) 192(CB5_NC) 194(CB1_NC) 196(DQS8_C) 197(DQS8_T) 199(CB7_NC) 201(CB3_NC) 205(RFU_205) 227(RFU_227) 230(NC2_SAVE) 234(A17_NC) 235(C_2_NC) 237(S3_N_C_1)

### Notes on the sheet
- 更新日期
- 2025-10-09
- 原理图
- 图页
- SCHEMATIC1
- DDR4_UDIMM CHANNEL-B0
- 创建日期
- 物料编码
- 审阅
- 绘制
- H610(2024/12/09)
- 版本
- V1.0
- 尺寸
- A3
- 页
- 7
- 嘉立创EDA
- 共
- 36
- (in symbol 90405-15112-2, part A) 1 OF 3
- (in symbol 90405-15112-2, part B) 2 of 3
- (in symbol 90405-15112-2, part C) 3 of 3

### Library data of the parts
C82 C83 C89 C90 = CL05A106MQ5NUNC: as C68 on sheet DDR4_UDIMM CHANNEL-A0; Device: CL05A106MQ5NUNC; Value: 10uF; Supplier: LCSC; Datasheet: https://atta.szlcsc.com/upload/public/pdf/source/20220823/2B02EE04F8F211D38A52DCB16EB6BEBA.pdf; SupplierPart: C15525; ConvertToPcb: yes; LCSC Part Name: 10uF ±20% 6.3V; JLCPCB Part Class: Basic Part; ManufacturerPart: CL05A106MQ5NUNC; Supplier Footprint: 0402
  C82 C83: FootprintName: C0603_1
  C89 C90: FootprintName: C0603_2
C84-C88 = CL05B104KO5NNNC: as C70 on sheet DDR4_UDIMM CHANNEL-A0; Device: CL05B104KO5NNNC; Value: 100nF; Supplier: LCSC; Datasheet: https://atta.szlcsc.com/upload/public/pdf/source/20160103/1457707674891.pdf; SupplierPart: C1525; ConvertToPcb: yes; LCSC Part Name: 100nF ±10% 16V; JLCPCB Part Class: Basic Part; ManufacturerPart: CL05B104KO5NNNC; Supplier Footprint: 0402
  C84 C87: FootprintName: C0402_1
  C85 C86 C88: FootprintName: C0402_3
C91 = CL10A106KP8NNNC: as C77 on sheet DDR4_UDIMM CHANNEL-A0; Device: CL10A106KP8NNNC; Value: 10uF; Supplier: LCSC; Datasheet: https://atta.szlcsc.com/upload/public/pdf/source/20160103/1457707703378.pdf; FootprintName: C0603_1; SupplierPart: C19702; ConvertToPcb: yes; LCSC Part Name: 10uF ±10% 10V; JLCPCB Part Class: Basic Part; ManufacturerPart: CL10A106KP8NNNC; Supplier Footprint: 0603
C92 C93 C95 = CL05B104KO5NNNC: as MC99 on sheet CPU_PWR - VCCIN_AUX; Device: CL05B104KO5NNNC; Value: 100nF; Supplier: LCSC; Datasheet: https://atta.szlcsc.com/upload/public/pdf/source/20160103/1457707674891.pdf; SupplierPart: C1525; ConvertToPcb: yes; LCSC Part Name: 100nF ±10% 16V; JLCPCB Part Class: Basic Part; ManufacturerPart: CL05B104KO5NNNC; Supplier Footprint: 0402
  C92 C95: FootprintName: C0402_1
  C93: FootprintName: C0402_3
C94 = CL10A226MQ8NRNC: as C80 on sheet DDR4_UDIMM CHANNEL-A0; Device: CL10A226MQ8NRNC; Value: 22uF; LCSC Part Name: 22uF ±20% 6.3V; SupplierPart: C59461; ManufacturerPart: CL10A226MQ8NRNC; Supplier Footprint: 0603; JLCPCB Part Class: Basic Part; Datasheet: https://atta.szlcsc.com/upload/public/pdf/source/20160218/1457707763339.pdf; Supplier: LCSC; ConvertToPcb: yes; FootprintName: C0603_2
DIMMB1 = 90405-15112-2: as DIMMA1 on sheet DDR4_UDIMM CHANNEL-A0; Device: 90405-15112-2; LCSC Part Name: 0.85mm P数:288P; SupplierPart: C2922446; ManufacturerPart: 90405-15112-2; Supplier Footprint: 插件,P=0.85mm; JLCPCB Part Class: Extended Part; Datasheet: https://atta.szlcsc.com/upload/public/pdf/source/20211119/8F83E07E75D2FB3E34252D81E838E37C.pdf; Supplier: LCSC; ConvertToPcb: yes; FootprintName: DDR4-288P-AKL_1; Number of Pins: 288P; Mounting Style: 直插; Height Above Board: 21mm; Contact Material: 铜合金; Contact Plating: 金; Operating Temperature Range: -55℃~+105℃
R28 = 0402WGF2000TCE: as R22 on sheet DDR4_UDIMM CHANNEL-A0; Device: 0402WGF2000TCE; Value: 200Ω; Type: 厚膜电阻; Supplier: LCSC; Datasheet: https://atta.szlcsc.com/upload/public/pdf/source/20200306/C422600_1E6D84923E4A46A82E41ADD87F860B5C.pdf; FootprintName: R0402_1; SupplierPart: C25087; ConvertToPcb: yes; LCSC Part Name: 200Ω ±1% 62.5mW; JLCPCB Part Class: Basic Part; ManufacturerPart: 0402WGF2000TCE; Supplier Footprint: 0402; Operating Temperature Range: -55℃~+155℃
R29 = 0402WGF1001TCE: 电阻类型:厚膜电阻;阻值:1kΩ;精度:±1%;功率:62.5mW;; Manufacturer: UNI-ROYAL(厚声); Symbol: 42A**-F; PCB Footprint: R0402; ModelId: 671aefced39d4c318694bba8bd8efd39; Tolerance: ±1%; AddInBom: yes; Power(Watts): 62.5mW; ModelName: R0402_L1.0-W0.5-H0.5; ModelTransform: 39.37,19.685,0,0,0,0,0,0.0005,0; Overload Voltage (Max): 50V; Temperature Coefficient: ±100ppm/℃; Device: 0402WGF1001TCE; Value: 1kΩ; Type: 厚膜电阻; Supplier: LCSC; Datasheet: https://atta.szlcsc.com/upload/public/pdf/source/20200306/C422600_1E6D84923E4A46A82E41ADD87F860B5C.pdf; FootprintName: R0402_3; SupplierPart: C11702; ConvertToPcb: yes; LCSC Part Name: 1kΩ ±1% 62.5mW; JLCPCB Part Class: Basic Part; ManufacturerPart: 0402WGF1001TCE; Supplier Footprint: 0402; Operating Temperature Range: -55℃~+155℃

## Sheet DISPLAY - HDMI 2.0.schdoc
size 420 x 298 mm; Symbol: Sheet-Symbol_A3; Company: 嘉立创EDA; Version: V1.0; Page Size: A3; @Project Name: 【全网首发】X86电脑主板_copy; @Page Count: 14; @Update Date: 2025-10-09; @Create Date: 2025-10-09; @Schematic Name: SCHEMATIC1_1; @Page No: 0; @Page Name: DISPLAY - HDMI 2.0; Device: Sheet-Symbol_A3
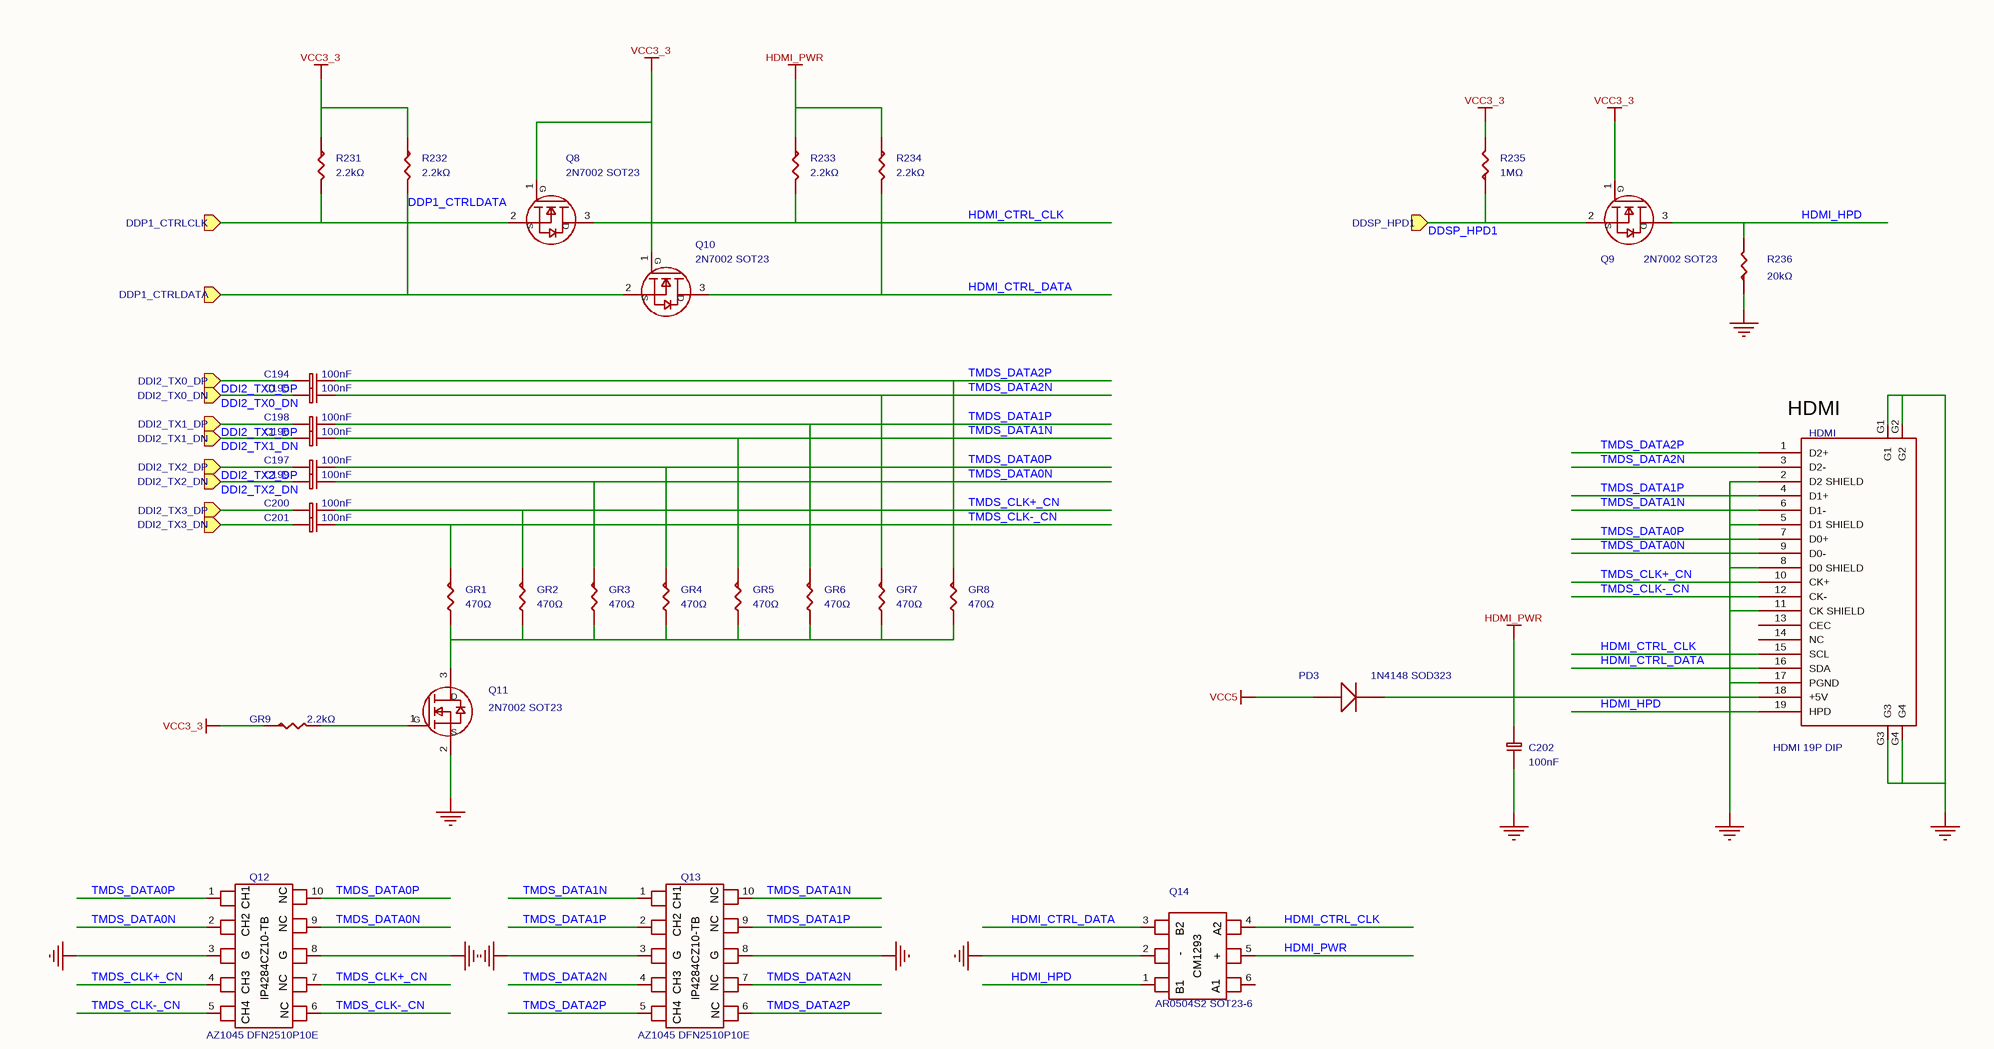
[diagram p24: DISPLAY - HDMI 2.0.schdoc]

### Parts
C194  100nF  [C0402]
C195  100nF  [C0402]
C196  100nF  [C0402]
C197  100nF  [C0402]
C198  100nF  [C0402]
C199  100nF  [C0402]
C200  100nF  [C0402]
C201  100nF  [C0402]
C202  100nF  [C0402]
GR1  470Ω  [R0402_2]
GR2  470Ω  [R0402_2]
GR3  470Ω  [R0402_2]
GR4  470Ω  [R0402_2]
GR5  470Ω  [R0402_2]
GR6  470Ω  [R0402_2]
GR7  470Ω  [R0402_2]
GR8  470Ω  [R0402_2]
GR9  2.2kΩ  [R0402_3]
HDMI  value HDMI 19P DIP  [HDMI3F19_2H61_AKL]  (hidden comment: CONN HDMI_0)
PD3  value 1N4148 SOD323  [1N4148WS-7-SOD323]  (hidden comment: 1N4148WS)
Q8  value 2N7002 SOT23  [SOT23_126]  (hidden comment: 2N7002)
Q9  value 2N7002 SOT23  [SOT23_126]  (hidden comment: 2N7002)
Q10  value 2N7002 SOT23  [SOT23_126]  (hidden comment: 2N7002)
Q11  value 2N7002 SOT23  [SOT23_126]  (hidden comment: 2N7002)
Q12  value AZ1045 DFN2510P10E  [DFN2510P10E]  (hidden comment: AZ1045-04F)
Q13  value AZ1045 DFN2510P10E  [DFN2510P10E_1]  (hidden comment: AZ1045-04F)
Q14  value AR0504S2 SOT23-6  [SOT23-6P-20051228_1]  (hidden comment: SRV05-4)
R231  2.2kΩ  [R0402_3]
R232  2.2kΩ  [R0402_3]
R233  2.2kΩ  [R0402_1]
R234  2.2kΩ  [R0402_3]
R235  1MΩ  [R0402_1]
R236  20kΩ  [R0402_3]

### Ports
DDI2_TX0_DN (in), DDI2_TX0_DP (in), DDI2_TX1_DN (in), DDI2_TX1_DP (in), DDI2_TX2_DN (in), DDI2_TX2_DP (in), DDI2_TX3_DN (in), DDI2_TX3_DP (in), DDP1_CTRLCLK (in), DDP1_CTRLDATA (in), DDSP_HPD1 (in)

### Nets
GND: C202.2 HDMI.2(D2_SHIELD) HDMI.5(D1_SHIELD) HDMI.8(D0_SHIELD) HDMI.11(CK_SHIELD) HDMI.17(PGND) HDMI.G1 HDMI.G2 HDMI.G3 HDMI.G4 Q11.2(S) Q12.3 Q12.8 Q13.3 Q13.8 Q14.2 R236.1
HDMI_PWR: C202.1 HDMI.18(+5V) PD3.1(C) Q14.5(+) R233.1 R234.1
VCC3_3: GR9.1 Q8.1(G) Q9.1(G) Q10.1(G) R231.1 R232.1 R235.2
VCC5: PD3.2(A)
DDI2_TX0_DN: C195.2 ; port DDI2_TX0_DN
DDI2_TX0_DP: C194.2 ; port DDI2_TX0_DP
DDI2_TX1_DN: C196.2 ; port DDI2_TX1_DN
DDI2_TX1_DP: C198.2 ; port DDI2_TX1_DP
DDI2_TX2_DN: C199.2 ; port DDI2_TX2_DN
DDI2_TX2_DP: C197.2 ; port DDI2_TX2_DP
DDP1_CTRLDATA: Q10.2(S) R232.2 ; port DDP1_CTRLDATA
DDSP_HPD1: Q9.2(S) R235.1 ; port DDSP_HPD1
HDMI_CTRL_CLK: HDMI.15(SCL) Q8.3(D) Q14.4 R233.2
HDMI_CTRL_DATA: HDMI.16(SDA) Q10.3(D) Q14.3 R234.2
HDMI_HPD: HDMI.19(HPD) Q9.3(D) Q14.1 R236.2
TMDS_CLK+_CN: C200.1 GR2.1 HDMI.10(CK+) Q12.4 Q12.7
TMDS_CLK-_CN: C201.1 GR1.1 HDMI.12(CK-) Q12.5(+) Q12.6
TMDS_DATA0N: C199.1 GR3.1 HDMI.9(D0-) Q12.2 Q12.9
TMDS_DATA0P: C197.1 GR4.1 HDMI.7(D0+) Q12.1 Q12.10
TMDS_DATA1N: C196.1 GR5.1 HDMI.6(D1-) Q13.1 Q13.10
TMDS_DATA1P: C198.1 GR6.1 HDMI.4(D1+) Q13.2 Q13.9
TMDS_DATA2N: C195.1 GR7.1 HDMI.3(D2-) Q13.4 Q13.7
TMDS_DATA2P: C194.1 GR8.1 HDMI.1(D2+) Q13.5(+) Q13.6
NetC200_2: C200.2 ; port DDI2_TX3_DP
NetC201_2: C201.2 ; port DDI2_TX3_DN
NetGR1_2: GR1.2 GR2.2 GR3.2 GR4.2 GR5.2 GR6.2 GR7.2 GR8.2 Q11.3(D)
NetGR9_2: GR9.2 Q11.1(G)
NetQ8_2: Q8.2(S) R231.2 ; port DDP1_CTRLCLK

Not connected (* = marked no-connect by the designer): HDMI 13(CEC) 14(NC); Q14 6

### Notes on the sheet
- (near HDMI) HDMI
- 更新日期
- 2025-10-09
- 原理图
- 图页
- SCHEMATIC1_1
- DISPLAY - HDMI 2.0
- 创建日期
- 物料编码
- 审阅
- 绘制
- 【全网首发】X86电脑主板_copy
- 版本
- V1.0
- 尺寸
- A3
- 页
- 0
- 嘉立创EDA
- 共
- 14
- (in symbol AZ1045-04F) CH1; NC; CH2; G; CH3; IP4284CZ10-TB; CH4
- (in symbol SRV05-4_C558418) B2; A2; CM1293; -; B1; A1

### Library data of the parts
C194-C201 = CL05B104KO5NNNC: as C70 on sheet DDR4_UDIMM CHANNEL-A0; Device: CL05B104KO5NNNC; Value: 100nF; Supplier: LCSC; Datasheet: https://atta.szlcsc.com/upload/public/pdf/source/20160103/1457707674891.pdf; FootprintName: C0402; SupplierPart: C1525; ConvertToPcb: yes; LCSC Part Name: 100nF ±10% 16V; JLCPCB Part Class: Basic Part; ManufacturerPart: CL05B104KO5NNNC; Supplier Footprint: 0402
C202 = CL05B104KO5NNNC: 容值:100nF;精度:±10%;额定电压:16V;材质(温度系数):X7R;; Manufacturer: SAMSUNG(三星); Symbol: CAP; Tolerance: ±10%; ModelId: 36a51122f27c49738f86b3bfa98863e0; AddInBom: yes; Voltage Rated: 16V; ModelName: C0402_L1.0-W0.5-H0.5; ModelTransform: 39.37,19.685,0,0,0,0,0,0,0; Temperature Coefficient: X7R; Device: CL05B104KO5NNNC; PCB Footprint: C0402; Value: 100nF; Supplier: LCSC; Datasheet: https://atta.szlcsc.com/upload/public/pdf/source/20160103/1457707674891.pdf; FootprintName: C0402; SupplierPart: C1525; ConvertToPcb: yes; LCSC Part Name: 100nF ±10% 16V; JLCPCB Part Class: Basic Part; ManufacturerPart: CL05B104KO5NNNC; Supplier Footprint: 0402
GR1-GR8 = 0402WGF4700TCE: 电阻类型:厚膜电阻;阻值:470Ω;精度:±1%;功率:62.5mW;; Manufacturer: UNI-ROYAL(厚声); Symbol: R-0603; ModelId: 671aefced39d4c318694bba8bd8efd39; Tolerance: ±1%; AddInBom: yes; Power(Watts): 62.5mW; ModelName: R0402_L1.0-W0.5-H0.5; ModelTransform: 39.37,19.685,0,0,0,0,0,0.0005,0; Overload Voltage (Max): 50V; Temperature Coefficient: ±100ppm/℃; Device: 0402WGF4700TCE; Value: 470Ω; Type: 厚膜电阻; Supplier: LCSC; Datasheet: https://atta.szlcsc.com/upload/public/pdf/source/20200306/C422600_1E6D84923E4A46A82E41ADD87F860B5C.pdf; FootprintName: R0402_2; SupplierPart: C25117; ConvertToPcb: yes; LCSC Part Name: 470Ω ±1% 62.5mW; JLCPCB Part Class: Basic Part; ManufacturerPart: 0402WGF4700TCE; Supplier Footprint: 0402; Operating Temperature Range: -55℃~+155℃
GR9 = 0402WGF2201TCE: as PR21 on sheet DDR4_PWR - +VDDQ_+VTT_+VPP; Device: 0402WGF2201TCE; Value: 2.2kΩ; Type: 厚膜电阻; Supplier: LCSC; Datasheet: https://atta.szlcsc.com/upload/public/pdf/source/20200306/C422600_1E6D84923E4A46A82E41ADD87F860B5C.pdf; FootprintName: R0402_3; SupplierPart: C25879; ConvertToPcb: yes; LCSC Part Name: 2.2kΩ ±1% 62.5mW; JLCPCB Part Class: Basic Part; ManufacturerPart: 0402WGF2201TCE; Supplier Footprint: 0402; Operating Temperature Range: -55℃~+155℃
HDMI = CONN HDMI_0: AddInBom: yes; Device: CONN HDMI_0; Symbol: CONN HDMI_0; Supplier Part: C2926858; FootprintName: HDMI3F19_2H61_AKL; ConvertToPcb: yes
PD3 = 1N4148WS_C917117: as PD7 on sheet CPU_PWR - VCCIN_AUX; Device: 1N4148WS_C917117; LCSC Part Name: 电压:100V 电流:300mA; SupplierPart: C917117; ManufacturerPart: 1N4148WS; Supplier Footprint: SOD-323; JLCPCB Part Class: Extended Part; Datasheet: https://atta.szlcsc.com/upload/public/pdf/source/20230807/08D9F448A82EA88A23B325A669586A09.pdf; Supplier: LCSC; ConvertToPcb: yes; FootprintName: 1N4148WS-7-SOD323; Forward Voltage (Vf@If): 1.25V@150mA; Operating Temperature: -55℃~+150℃@(Tj)
Q8-Q11 = 2N7002_C8545: as Q33 on sheet CPU_PWR - VCCIN_AUX; Device: 2N7002_C8545; Supplier: LCSC; Datasheet: https://atta.szlcsc.com/upload/public/pdf/source/20170302/1488422688078.pdf; FootprintName: SOT23_126; SupplierPart: C8545; ConvertToPcb: yes; LCSC Part Name: N沟道 60V 115mA; JLCPCB Part Class: Basic Part; ManufacturerPart: 2N7002; Supplier Footprint: SOT-23; Gate Threshold Voltage (Vgs(th)@Id): 2.5V@250uA; Drain Source On Resistance (RDS(on)@Vgs,Id): 7.5Ω@10V,500mA
Q12 Q13 = AZ1045-04F: Manufacturer: TECH PUBLIC(台舟); Symbol: CM1293_1; AddInBom: yes; ModelId: 55525fa8fc914f7c8ffcb10749ea5f73; ModelName: DFN-10_L2.5-W1.0-H0.5-P0.50; ModelTransform: 40.1574,98.425,0,90,0,0,0,0,0; Type: ESD; Device: AZ1045-04F; LCSC Part Name: AZ1045-04F; SupplierPart: C2987152; ManufacturerPart: AZ1045-04F; Supplier Footprint: DFN2510-10; JLCPCB Part Class: Extended Part; Datasheet: https://atta.szlcsc.com/upload/public/pdf/source/20220406/8EAFF16680D4CFE618D2B8CBCD10F1DA.pdf; Supplier: LCSC; ConvertToPcb: yes
  Q12: FootprintName: DFN2510P10E
  Q13: FootprintName: DFN2510P10E_1
Q14 = SRV05-4_C558418: 反向截止电压(Vrwm):5V;最大钳位电压:20V;峰值脉冲电流(Ipp)@10/1000us:3A;击穿电压:6V;; Manufacturer: TECH PUBLIC(台舟); Symbol: CM1293_0; AddInBom: yes; ModelId: 18da8f6c14a34920b3e136b5c401a119; ModelName: SOT-23-6_L2.9-W1.6-H1.5-LS2.8-P0.95; ModelTransform: 110.236,113.364,0,90,0,0,0.0005,0.0005,0; Reverse Stand-Off Voltage (Vrwm): 5V; Maximum Clamping Voltage: 20V; Peak Pulse Current (Ipp)@10/1000us: 3A; Breakdown Voltage: 6V; Type: ESD; Device: SRV05-4_C558418; LCSC Part Name: ESD，可防25kV静电; SupplierPart: C558418; ManufacturerPart: SRV05-4; Supplier Footprint: SOT-23-6; JLCPCB Part Class: Extended Part; Datasheet: https://atta.szlcsc.com/upload/public/pdf/source/20230615/CFFDFFE99FDA0E92DF9600783B3A2A20.pdf; Supplier: LCSC; ConvertToPcb: yes; FootprintName: SOT23-6P-20051228_1
R231-R234 = 0402WGF2201TCE: 电阻类型:厚膜电阻;阻值:2.2kΩ;精度:±1%;功率:62.5mW;; Manufacturer: UNI-ROYAL(厚声); Symbol: RESISTOR; ModelId: 671aefced39d4c318694bba8bd8efd39; Tolerance: ±1%; AddInBom: yes; Power(Watts): 62.5mW; ModelName: R0402_L1.0-W0.5-H0.5; ModelTransform: 39.37,19.685,0,0,0,0,0,0.0005,0; Overload Voltage (Max): 50V; Temperature Coefficient: ±100ppm/℃; Device: 0402WGF2201TCE; Value: 2.2kΩ; Type: 厚膜电阻; Supplier: LCSC; Datasheet: https://atta.szlcsc.com/upload/public/pdf/source/20200306/C422600_1E6D84923E4A46A82E41ADD87F860B5C.pdf; SupplierPart: C25879; ConvertToPcb: yes; LCSC Part Name: 2.2kΩ ±1% 62.5mW; JLCPCB Part Class: Basic Part; ManufacturerPart: 0402WGF2201TCE; Supplier Footprint: 0402; Operating Temperature Range: -55℃~+155℃
  R231 R232 R234: FootprintName: R0402_3
  R233: FootprintName: R0402_1
R235 = 0402WGF1004TCE: 电阻类型:厚膜电阻;阻值:1MΩ;精度:±1%;功率:62.5mW;; Manufacturer: UNI-ROYAL(厚声); Symbol: RESISTOR; ModelId: 671aefced39d4c318694bba8bd8efd39; Tolerance: ±1%; AddInBom: yes; Power(Watts): 62.5mW; ModelName: R0402_L1.0-W0.5-H0.5; ModelTransform: 39.37,19.685,0,0,0,0,0,0.0005,0; Overload Voltage (Max): 50V; Temperature Coefficient: ±100ppm/℃; Device: 0402WGF1004TCE; Value: 1MΩ; Type: 厚膜电阻; Supplier: LCSC; Datasheet: https://atta.szlcsc.com/upload/public/pdf/source/20200306/C422600_1E6D84923E4A46A82E41ADD87F860B5C.pdf; FootprintName: R0402_1; SupplierPart: C26083; ConvertToPcb: yes; LCSC Part Name: 1MΩ ±1% 62.5mW; JLCPCB Part Class: Basic Part; ManufacturerPart: 0402WGF1004TCE; Supplier Footprint: 0402; Operating Temperature Range: -55℃~+155℃
R236 = 0402WGF2002TCE: 电阻类型:厚膜电阻;阻值:20kΩ;精度:±1%;功率:62.5mW;; Manufacturer: UNI-ROYAL(厚声); Symbol: RESISTOR; ModelId: 671aefced39d4c318694bba8bd8efd39; Tolerance: ±1%; AddInBom: yes; Power(Watts): 62.5mW; ModelName: R0402_L1.0-W0.5-H0.5; ModelTransform: 39.37,19.685,0,0,0,0,0,0.0005,0; Overload Voltage (Max): 50V; Temperature Coefficient: ±100ppm/℃; Device: 0402WGF2002TCE; Value: 20kΩ; Type: 厚膜电阻; Supplier: LCSC; Datasheet: https://atta.szlcsc.com/upload/public/pdf/source/20200306/C422600_1E6D84923E4A46A82E41ADD87F860B5C.pdf; FootprintName: R0402_3; SupplierPart: C25765; ConvertToPcb: yes; LCSC Part Name: 20kΩ ±1% 62.5mW; JLCPCB Part Class: Basic Part; ManufacturerPart: 0402WGF2002TCE; Supplier Footprint: 0402; Operating Temperature Range: -55℃~+155℃